# Altium project ARGUSPrjPcb.PrjPcb (part 1 of 2)
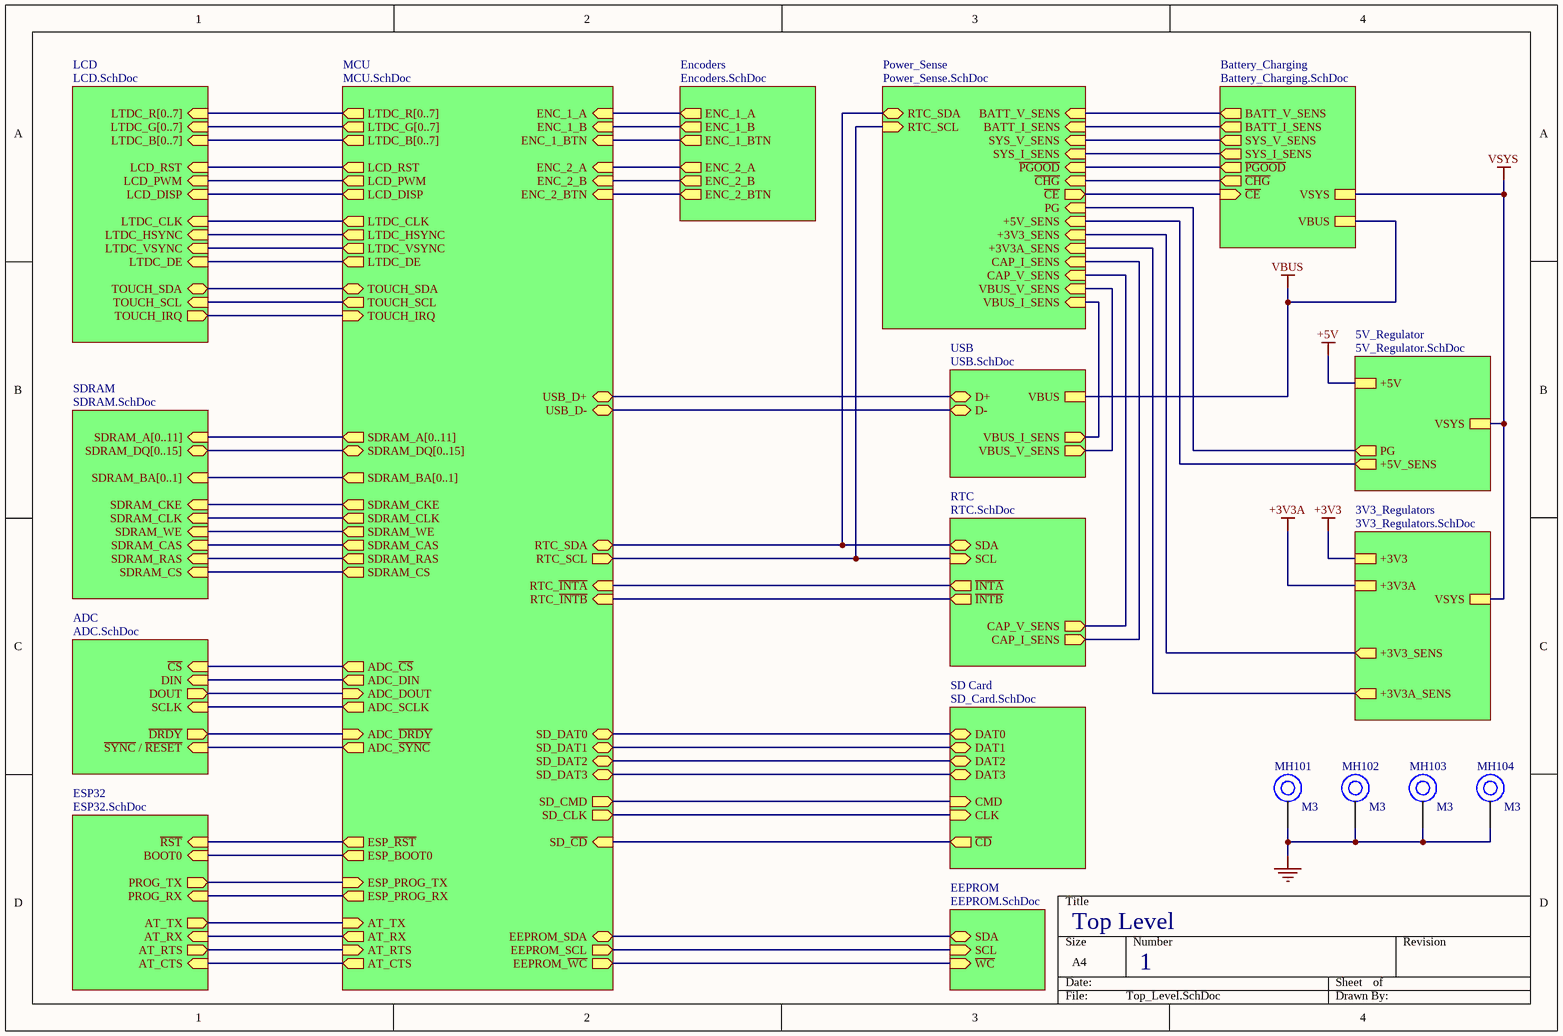
[diagram p0: Top_Level.SchDoc]
18 sheets, 452 parts. Net scope: hierarchical (ports join the sheet entries above them; power ports are global).
Board file: ARGUS.PcbDoc
Sheets:
  Top_Level.SchDoc
    MCU = MCU.SchDoc
      Designator = MCU_Peripherals.SchDoc
      MCU_Power = MCU_Power.SchDoc
    LCD = LCD.SchDoc
    SDRAM = SDRAM.SchDoc
    ADC = ADC.SchDoc
      CH0 = ADC_Frontend.SchDoc
      ADC_Frontend = ADC_Frontend.SchDoc
      ADC_Frontend = ADC_Frontend.SchDoc
      ADC_Frontend = ADC_Frontend.SchDoc
      ADC_Frontend = ADC_Frontend.SchDoc
      ADC_Frontend = ADC_Frontend.SchDoc
      ADC_Frontend = ADC_Frontend.SchDoc
      ADC_Frontend = ADC_Frontend.SchDoc
    Battery_Charging = Battery_Charging.SchDoc
    USB = USB.SchDoc
    EEPROM = EEPROM.SchDoc
    RTC = RTC.SchDoc
    SD Card = SD_Card.SchDoc
    5V_Regulator = 5V_Regulator.SchDoc
    3V3_Regulators = 3V3_Regulators.SchDoc
    ESP32 = ESP32.SchDoc
    Power_Sense = Power_Sense.SchDoc
    Encoders = Encoders.SchDoc

## Sheet Top_Level.SchDoc: Top Level
size A4; DocumentNumber: 1; SheetNumber: 1; SheetTotal: 18

### Parts
MH101  M3  [M3_Mounting_Hole]
MH102  M3  [M3_Mounting_Hole]
MH103  M3  [M3_Mounting_Hole]
MH104  M3  [M3_Mounting_Hole]

### Sub-sheets
3V3_Regulators = 3V3_Regulators.SchDoc: +3V3, VSYS, +3V3_SENS (out), +3V3A, +3V3A_SENS (out)
5V_Regulator = 5V_Regulator.SchDoc: +5V, VSYS, PG (out), +5V_SENS (out)
ADC = ADC.SchDoc: ~{CS} (in), DIN (in), DOUT (out), SCLK (in), ~{DRDY} (out), ~{SYNC} / ~{RESET} (in)
Battery_Charging = Battery_Charging.SchDoc: VBUS, BATT_V_SENS (out), BATT_I_SENS (out), SYS_V_SENS (out), SYS_I_SENS (out), ~{PGOOD} (out), ~{CHG} (out), ~{CE} (in), VSYS
EEPROM = EEPROM.SchDoc: SDA (bidir), SCL (in), ~{WC} (in)
Encoders = Encoders.SchDoc: ENC_1_A (out), ENC_1_B (out), ENC_1_BTN (out), ENC_2_BTN (out), ENC_2_B (out), ENC_2_A (out)
ESP32 = ESP32.SchDoc: ~{RST} (in), BOOT0 (in), PROG_RX (in), PROG_TX (out), AT_TX (out), AT_RX (in), AT_RTS (out), AT_CTS (in)
LCD = LCD.SchDoc: LTDC_B[0..7] (in), LTDC_G[0..7] (in), LTDC_R[0..7] (in), LCD_RST (in), LCD_PWM (in), TOUCH_SDA (bidir), TOUCH_SCL (in), TOUCH_IRQ (out), LTDC_DE (in), LTDC_VSYNC (in), LTDC_HSYNC (in), LTDC_CLK (in), LCD_DISP (in)
MCU = MCU.SchDoc: LTDC_B[0..7] (out), LTDC_G[0..7] (out), LTDC_R[0..7] (out), EEPROM_SDA (bidir), EEPROM_SCL (out), EEPROM_~{WC} (out), AT_CTS (out), AT_RTS (in), AT_RX (out), AT_TX (in), ESP_PROG_RX (out), ESP_PROG_TX (in), ESP_BOOT0 (out), ESP_~{RST} (out), ADC_~{SYNC} (out), ADC_~{DRDY} (in), ADC_SCLK (out), ADC_DOUT (in), ADC_DIN (out), ADC_~{CS} (out), SDRAM_CS (out), SDRAM_RAS (out), SDRAM_CAS (out), SDRAM_WE (out), SDRAM_CLK (out), SDRAM_CKE (out), SDRAM_BA[0..1] (out), SDRAM_DQ[0..15] (bidir), SDRAM_A[0..11] (out), LCD_RST (out), LCD_PWM (out), TOUCH_IRQ (in), TOUCH_SCL (out), TOUCH_SDA (bidir), LTDC_CLK (out), LCD_DISP (out), LTDC_HSYNC (out), LTDC_VSYNC (out), LTDC_DE (out), SD_~{CD} (in), SD_CLK (out), SD_CMD (out), SD_DAT3 (bidir), SD_DAT2 (bidir), SD_DAT1 (bidir), SD_DAT0 (bidir), RTC_~{INTB} (in), RTC_~{INTA} (in), RTC_SCL (out), RTC_SDA (bidir), USB_D- (bidir), USB_D+ (bidir), ENC_1_A (in), ENC_1_B (in), ENC_1_BTN (in), ENC_2_A (in), ENC_2_B (in), ENC_2_BTN (in)
Power_Sense = Power_Sense.SchDoc: BATT_V_SENS (in), BATT_I_SENS (in), SYS_V_SENS (in), SYS_I_SENS (in), ~{PGOOD} (in), ~{CHG} (in), ~{CE} (out), PG (in), +5V_SENS (in), +3V3_SENS (in), +3V3A_SENS (in), CAP_I_SENS (in), CAP_V_SENS (in), VBUS_V_SENS (in), VBUS_I_SENS (in), RTC_SDA (bidir), RTC_SCL (in)
RTC = RTC.SchDoc: SDA (bidir), SCL (in), ~{INTA} (out), ~{INTB} (out), CAP_I_SENS (out), CAP_V_SENS (out)
SD Card = SD_Card.SchDoc: DAT0 (bidir), DAT1 (bidir), DAT3 (bidir), DAT2 (bidir), CMD (in), CLK (in), ~{CD} (out)
SDRAM = SDRAM.SchDoc: SDRAM_BA[0..1] (in), SDRAM_A[0..11] (in), SDRAM_CKE (in), SDRAM_CLK (in), SDRAM_WE (in), SDRAM_CAS (in), SDRAM_RAS (in), SDRAM_CS (in), SDRAM_DQ[0..15] (bidir)
USB = USB.SchDoc: D+ (bidir), D- (bidir), VBUS, VBUS_V_SENS (out), VBUS_I_SENS (out)

### Nets
GND: MH101.1 MH102.1 MH103.1 MH104.1
VBUS: sheet Battery_Charging/VBUS, sheet USB/VBUS
VSYS: sheet Battery_Charging/VSYS, sheet 5V_Regulator/VSYS, sheet 3V3_Regulators/VSYS
+3V3_V_SENS: sheet 3V3_Regulators/+3V3_SENS, sheet Power_Sense/+3V3_SENS
+3V3A_V_SENS: sheet 3V3_Regulators/+3V3A_SENS, sheet Power_Sense/+3V3A_SENS
+5V_SENS: sheet 5V_Regulator/+5V_SENS, sheet Power_Sense/+5V_SENS
ADC_~{CS}: sheet MCU/ADC_~{CS}, sheet ADC/~{CS}
ADC_~{DRDY}: sheet MCU/ADC_~{DRDY}, sheet ADC/~{DRDY}
ADC_DIN: sheet MCU/ADC_DIN, sheet ADC/DIN
ADC_DOUT: sheet MCU/ADC_DOUT, sheet ADC/DOUT
ADC_~{SYNC}: sheet MCU/ADC_~{SYNC}, sheet ADC/~{SYNC} / ~{RESET}
ADC_SCLK: sheet MCU/ADC_SCLK, sheet ADC/SCLK
AT_CTS: sheet MCU/AT_CTS, sheet ESP32/AT_CTS
AT_RTS: sheet MCU/AT_RTS, sheet ESP32/AT_RTS
AT_RX: sheet MCU/AT_RX, sheet ESP32/AT_RX
AT_TX: sheet MCU/AT_TX, sheet ESP32/AT_TX
BATT_I_SENS: sheet Battery_Charging/BATT_I_SENS, sheet Power_Sense/BATT_I_SENS
BATT_V_SENS: sheet Battery_Charging/BATT_V_SENS, sheet Power_Sense/BATT_V_SENS
BOOT0: sheet MCU/ESP_BOOT0, sheet ESP32/BOOT0
~{CD}: sheet MCU/SD_~{CD}, sheet SD Card/~{CD}
~{CE}: sheet Battery_Charging/~{CE}, sheet Power_Sense/~{CE}
~{CHG}: sheet Battery_Charging/~{CHG}, sheet Power_Sense/~{CHG}
CAP_I_SENS: sheet RTC/CAP_I_SENS, sheet Power_Sense/CAP_I_SENS
CAP_V_SENS: sheet RTC/CAP_V_SENS, sheet Power_Sense/CAP_V_SENS
CLK: sheet MCU/SD_CLK, sheet SD Card/CLK
CMD: sheet MCU/SD_CMD, sheet SD Card/CMD
DAT0: sheet MCU/SD_DAT0, sheet SD Card/DAT0
DAT1: sheet MCU/SD_DAT1, sheet SD Card/DAT1
DAT2: sheet MCU/SD_DAT2, sheet SD Card/DAT2
DAT3: sheet MCU/SD_DAT3, sheet SD Card/DAT3
EEPROM_SCL: sheet MCU/EEPROM_SCL, sheet EEPROM/SCL
EEPROM_SDA: sheet MCU/EEPROM_SDA, sheet EEPROM/SDA
EEPROM_~{WC}: sheet MCU/EEPROM_~{WC}, sheet EEPROM/~{WC}
ENC_1_A: sheet MCU/ENC_1_A, sheet Encoders/ENC_1_A
ENC_1_B: sheet MCU/ENC_1_B, sheet Encoders/ENC_1_B
ENC_1_BTN: sheet MCU/ENC_1_BTN, sheet Encoders/ENC_1_BTN
ENC_2_A: sheet MCU/ENC_2_A, sheet Encoders/ENC_2_A
ENC_2_B: sheet MCU/ENC_2_B, sheet Encoders/ENC_2_B
ENC_2_BTN: sheet MCU/ENC_2_BTN, sheet Encoders/ENC_2_BTN
ESP_PROG_RX: sheet MCU/ESP_PROG_RX, sheet ESP32/PROG_RX
ESP_PROG_TX: sheet MCU/ESP_PROG_TX, sheet ESP32/PROG_TX
ESP_~{RST}: sheet MCU/ESP_~{RST}, sheet ESP32/~{RST}
~{INT}A: sheet MCU/RTC_~{INTA}, sheet RTC/~{INTA}
~{INT}B: sheet MCU/RTC_~{INTB}, sheet RTC/~{INTB}
LCD_DISP: sheet MCU/LCD_DISP, sheet LCD/LCD_DISP
LCD_PWM: sheet MCU/LCD_PWM, sheet LCD/LCD_PWM
LCD_RST: sheet MCU/LCD_RST, sheet LCD/LCD_RST
LTDC_CLK: sheet MCU/LTDC_CLK, sheet LCD/LTDC_CLK
LTDC_DE: sheet MCU/LTDC_DE, sheet LCD/LTDC_DE
LTDC_HSYNC: sheet MCU/LTDC_HSYNC, sheet LCD/LTDC_HSYNC
LTDC_VSYNC: sheet MCU/LTDC_VSYNC, sheet LCD/LTDC_VSYNC
~{PGOOD}: sheet Battery_Charging/~{PGOOD}, sheet Power_Sense/~{PGOOD}
PG: sheet 5V_Regulator/PG, sheet Power_Sense/PG
RTC_SCL: sheet MCU/RTC_SCL, sheet RTC/SCL, sheet Power_Sense/RTC_SCL
RTC_SDA: sheet MCU/RTC_SDA, sheet RTC/SDA, sheet Power_Sense/RTC_SDA
SDRAM_CAS: sheet MCU/SDRAM_CAS, sheet SDRAM/SDRAM_CAS
SDRAM_CKE: sheet MCU/SDRAM_CKE, sheet SDRAM/SDRAM_CKE
SDRAM_CLK: sheet MCU/SDRAM_CLK, sheet SDRAM/SDRAM_CLK
SDRAM_CS: sheet MCU/SDRAM_CS, sheet SDRAM/SDRAM_CS
SDRAM_RAS: sheet MCU/SDRAM_RAS, sheet SDRAM/SDRAM_RAS
SDRAM_WE: sheet MCU/SDRAM_WE, sheet SDRAM/SDRAM_WE
SYS_I_SENS: sheet Battery_Charging/SYS_I_SENS, sheet Power_Sense/SYS_I_SENS
SYS_V_SENS: sheet Battery_Charging/SYS_V_SENS, sheet Power_Sense/SYS_V_SENS
TOUCH_IRQ: sheet MCU/TOUCH_IRQ, sheet LCD/TOUCH_IRQ
TOUCH_SCL: sheet MCU/TOUCH_SCL, sheet LCD/TOUCH_SCL
TOUCH_SDA: sheet MCU/TOUCH_SDA, sheet LCD/TOUCH_SDA
USB_D_N: sheet MCU/USB_D-, sheet USB/D-
USB_D_P: sheet MCU/USB_D+, sheet USB/D+
VBUS_I_SENS: sheet USB/VBUS_I_SENS, sheet Power_Sense/VBUS_I_SENS
VBUS_V_SENS: sheet USB/VBUS_V_SENS, sheet Power_Sense/VBUS_V_SENS

### Buses and harness runs
bus sheet LCD/LTDC_B[0..7] = sheet MCU/LTDC_B[0..7]
bus sheet LCD/LTDC_G[0..7] = sheet MCU/LTDC_G[0..7]
bus sheet LCD/LTDC_R[0..7] = sheet MCU/LTDC_R[0..7]
bus sheet MCU/SDRAM_A[0..11] = sheet SDRAM/SDRAM_A[0..11]
bus sheet MCU/SDRAM_BA[0..1] = sheet SDRAM/SDRAM_BA[0..1]
bus sheet MCU/SDRAM_DQ[0..15] = sheet SDRAM/SDRAM_DQ[0..15]

### Library data of the parts
MH101-MH104 = M3_Mounting_Hole

## Sheet MCU.SchDoc: MCU
size A4; DocumentNumber: 2; SheetNumber: 2; SheetTotal: 18
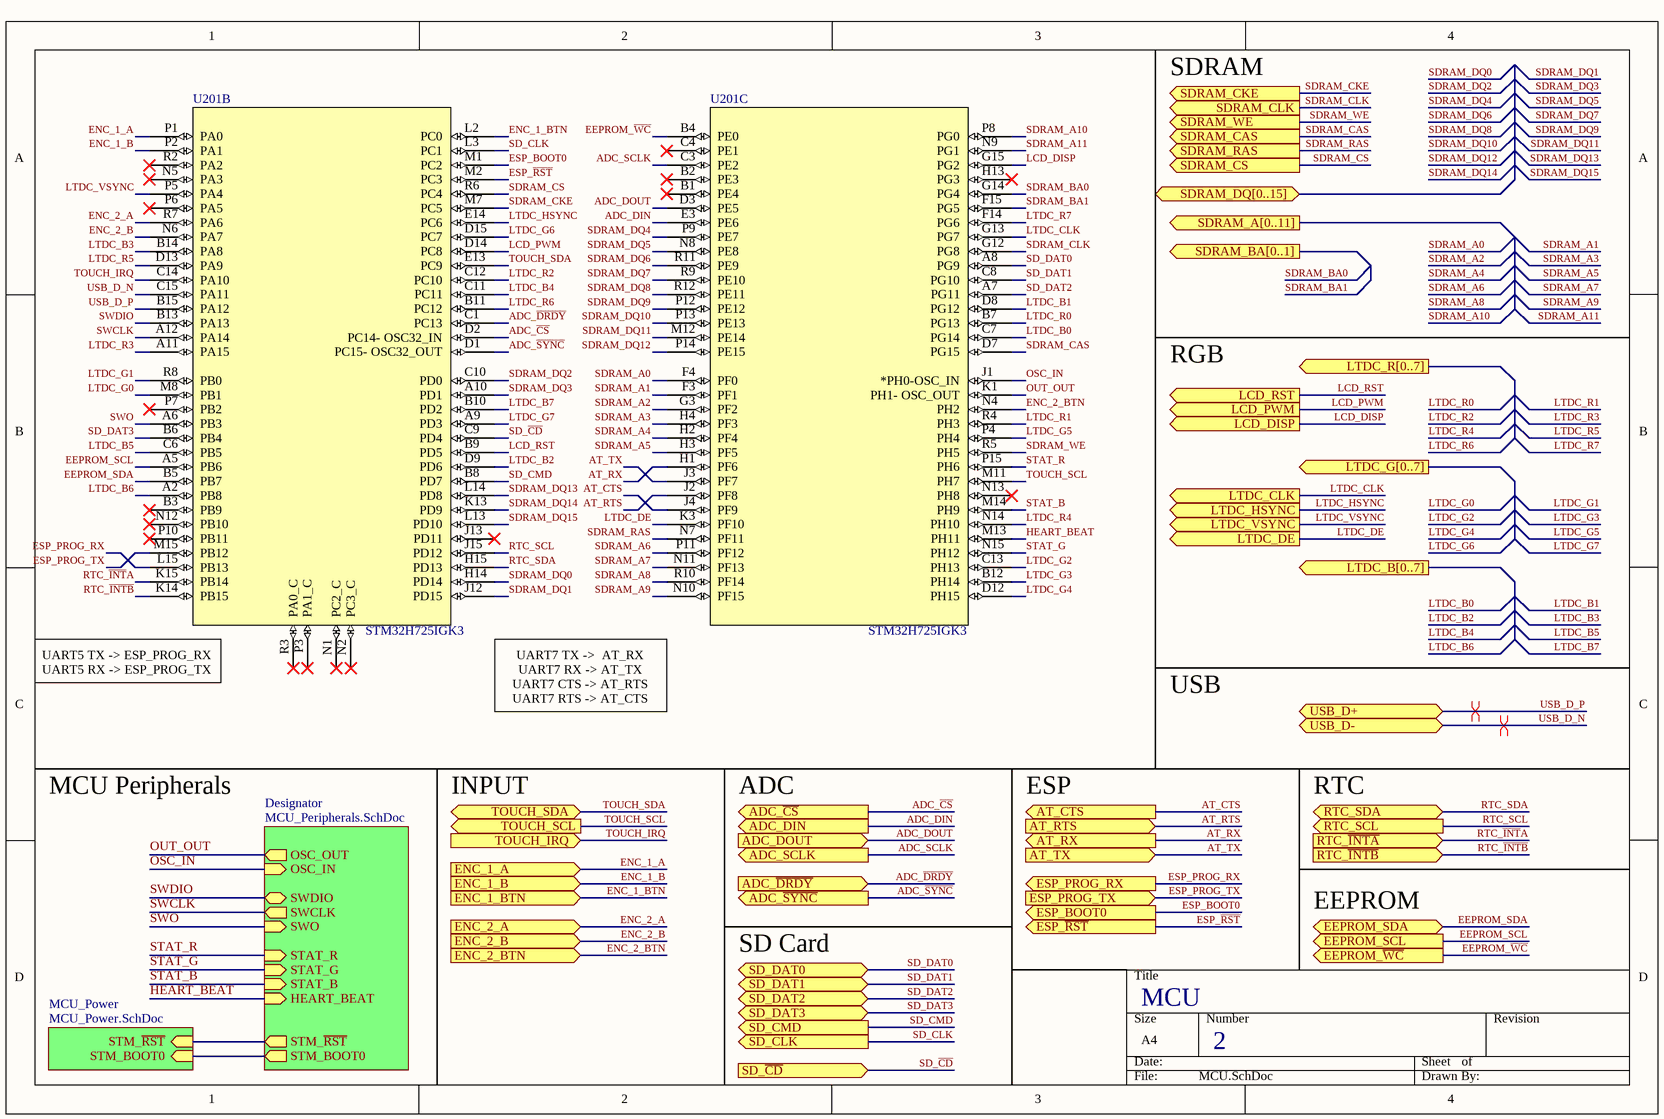
[diagram p1: MCU.SchDoc]

### Parts
U201  STM32H725IGK3  [STM32H725IGK3]  (parts B,C of 3)

### Sub-sheets
Designator = MCU_Peripherals.SchDoc: STM_BOOT0 (out), STM_~{RST} (out), OSC_IN (in), SWDIO (bidir), SWO (in), STAT_R (in), STAT_G (in), STAT_B (in), HEART_BEAT (in), OSC_OUT (out), SWCLK (out)
MCU_Power = MCU_Power.SchDoc: STM_~{RST} (in), STM_BOOT0 (in)

### Ports
ADC_DIN (out, see Top_Level[1C]), ADC_DOUT (in, see Top_Level[1C]), ADC_SCLK (out, see Top_Level[1C]), ADC_~{CS} (out, see Top_Level[1C]), ADC_~{DRDY} (in, see Top_Level[1C]), ADC_~{SYNC} (out, see Top_Level[1C]), AT_CTS (out, see Top_Level[1D], ESP32[4C]), AT_RTS (in, see Top_Level[1D], ESP32[4C]), AT_RX (out, see Top_Level[1D], ESP32[4C]), AT_TX (in, see Top_Level[1D], ESP32[4B]), EEPROM_SCL (out, see Top_Level[2D]), EEPROM_SDA (bidir, see Top_Level[2D]), EEPROM_~{WC} (out, see Top_Level[2D]), ENC_1_A (in, see Top_Level[2A], Encoders[2B]), ENC_1_B (in, see Top_Level[2A], Encoders[2B]), ENC_1_BTN (in, see Top_Level[2A], Encoders[2B]), ENC_2_A (in, see Top_Level[2A], Encoders[2A]), ENC_2_B (in, see Top_Level[2A], Encoders[2A]), ENC_2_BTN (in, see Top_Level[2A], Encoders[2B]), ESP_BOOT0 (out, see Top_Level[1D]), ESP_PROG_RX (out, see Top_Level[1D]), ESP_PROG_TX (in, see Top_Level[1D]), ESP_~{RST} (out, see Top_Level[1D]), LCD_DISP (out, see Top_Level[1A], LCD[1C]), LCD_PWM (out, see Top_Level[1A], LCD[1C]), LCD_RST (out, see Top_Level[1A], LCD[1C]), LTDC_B[0..7] (out, see Top_Level[1A], LCD[4A]), LTDC_CLK (out, see Top_Level[1A], LCD[4C]), LTDC_DE (out, see Top_Level[1B], LCD[4C]), LTDC_G[0..7] (out, see Top_Level[1A], LCD[3A]), LTDC_HSYNC (out, see Top_Level[1A], LCD[4C]), LTDC_R[0..7] (out, see Top_Level[1A], LCD[2A]), LTDC_VSYNC (out, see Top_Level[1A], LCD[1C]), RTC_SCL (out, see Top_Level[2C], Power_Sense[3B]), RTC_SDA (bidir, see Top_Level[2C], Power_Sense[3B]), RTC_~{INTA} (in, see Top_Level[2C]), RTC_~{INTB} (in, see Top_Level[2C]), SD_CLK (out, see Top_Level[2D]), SD_CMD (out, see Top_Level[2D]), SD_DAT0 (bidir, see Top_Level[2C]), SD_DAT1 (bidir, see Top_Level[2C]), SD_DAT2 (bidir, see Top_Level[2C]), SD_DAT3 (bidir, see Top_Level[2D]), SD_~{CD} (in, see Top_Level[2D]), SDRAM_A[0..11] (out, see Top_Level[1B], SDRAM[3C]), SDRAM_BA[0..1] (out, see Top_Level[1B], SDRAM[1B]), SDRAM_CAS (out, see Top_Level[1C], SDRAM[1B]), SDRAM_CKE (out, see Top_Level[1B], SDRAM[1B]), SDRAM_CLK (out, see Top_Level[1C], SDRAM[1B]), SDRAM_CS (out, see Top_Level[1C], SDRAM[1B]), SDRAM_DQ[0..15] (bidir, see Top_Level[1B], SDRAM[3A]), SDRAM_RAS (out, see Top_Level[1C], SDRAM[1B]), SDRAM_WE (out, see Top_Level[1C], SDRAM[1B]), TOUCH_IRQ (in, see Top_Level[1B], LCD[4C]), TOUCH_SCL (out, see Top_Level[1B], LCD[4C]), TOUCH_SDA (bidir, see Top_Level[1B], LCD[1C]), USB_D+ (bidir, see Top_Level[2B]), USB_D- (bidir, see Top_Level[2B])

### Nets
ADC_~{CS}: U201.D2(PC14-_OSC32_IN) ; port ADC_~{CS}
ADC_~{DRDY}: U201.C1(PC13) ; port ADC_~{DRDY}
ADC_DIN: U201.E3(PE6) ; port ADC_DIN
ADC_DOUT: U201.D3(PE5) ; port ADC_DOUT
ADC_~{SYNC}: U201.D1(PC15-_OSC32_OUT) ; port ADC_~{SYNC}
ADC_SCLK: U201.C3(PE2) ; port ADC_SCLK
AT_CTS: U201.J4(PF9) ; port AT_CTS
AT_RTS: U201.J2(PF8) ; port AT_RTS
AT_RX: U201.H1(PF6) ; port AT_RX
AT_TX: U201.J3(PF7) ; port AT_TX
EEPROM_SCL: U201.A5(PB6) ; port EEPROM_SCL
EEPROM_SDA: U201.B5(PB7) ; port EEPROM_SDA
EEPROM_~{WC}: U201.B4(PE0) ; port EEPROM_~{WC}
ENC_1_A: U201.P1(PA0) ; port ENC_1_A
ENC_1_B: U201.P2(PA1) ; port ENC_1_B
ENC_1_BTN: U201.L2(PC0) ; port ENC_1_BTN
ENC_2_A: U201.R7(PA6) ; port ENC_2_A
ENC_2_B: U201.N6(PA7) ; port ENC_2_B
ENC_2_BTN: U201.N4(PH2) ; port ENC_2_BTN
ESP_BOOT0: U201.M1(PC2) ; port ESP_BOOT0  [project net BOOT0]
ESP_PROG_RX: U201.L15(PB13) ; port ESP_PROG_RX
ESP_PROG_TX: U201.M15(PB12) ; port ESP_PROG_TX
ESP_~{RST}: U201.M2(PC3) ; port ESP_~{RST}
HEART_BEAT: U201.M13(PH11) ; sheet Designator/HEART_BEAT
LCD_DISP: U201.G15(PG2) ; port LCD_DISP
LCD_PWM: U201.D14(PC8) ; port LCD_PWM
LCD_RST: U201.B9(PD5) ; port LCD_RST
LTDC_B0: U201.C7(PG14)
LTDC_B1: U201.D8(PG12)
LTDC_B2: U201.D9(PD6)
LTDC_B3: U201.B14(PA8)
LTDC_B4: U201.C11(PC11)
LTDC_B5: U201.C6(PB5)
LTDC_B6: U201.A2(PB8)
LTDC_B7: U201.B10(PD2)
LTDC_CLK: U201.G13(PG7) ; port LTDC_CLK
LTDC_DE: U201.K3(PF10) ; port LTDC_DE
LTDC_G0: U201.M8(PB1)
LTDC_G1: U201.R8(PB0)
LTDC_G2: U201.C13(PH13)
LTDC_G3: U201.B12(PH14)
LTDC_G4: U201.D12(PH15)
LTDC_G5: U201.P4(PH4)
LTDC_G6: U201.D15(PC7)
LTDC_G7: U201.A9(PD3)
LTDC_HSYNC: U201.E14(PC6) ; port LTDC_HSYNC
LTDC_R0: U201.B7(PG13)
LTDC_R1: U201.R4(PH3)
LTDC_R2: U201.C12(PC10)
LTDC_R3: U201.A11(PA15)
LTDC_R4: U201.N14(PH10)
LTDC_R5: U201.D13(PA9)
LTDC_R6: U201.B11(PC12)
LTDC_R7: U201.F14(PG6)
LTDC_VSYNC: U201.P5(PA4) ; port LTDC_VSYNC
OSC_IN: U201.J1(*PH0-OSC_IN) ; sheet Designator/OSC_IN
OUT_OUT: U201.K1(PH1-_OSC_OUT) ; sheet Designator/OSC_OUT
~{RST}: sheet Designator/STM_~{RST}, sheet MCU_Power/STM_~{RST}
RTC_~{INT}A: U201.K15(PB14) ; port RTC_~{INTA}  [project net ~{INT}A]
RTC_~{INTB}: U201.K14(PB15) ; port RTC_~{INTB}  [project net ~{INT}B]
RTC_SCL: U201.J15(PD12) ; port RTC_SCL
RTC_SDA: U201.H15(PD13) ; port RTC_SDA
SD_~{CD}: U201.C9(PD4) ; port SD_~{CD}  [project net ~{CD}]
SD_CLK: U201.L3(PC1) ; port SD_CLK  [project net CLK]
SD_CMD: U201.B8(PD7) ; port SD_CMD  [project net CMD]
SD_DAT0: U201.A8(PG9) ; port SD_DAT0  [project net DAT0]
SD_DAT1: U201.C8(PG10) ; port SD_DAT1  [project net DAT1]
SD_DAT2: U201.A7(PG11) ; port SD_DAT2  [project net DAT2]
SD_DAT3: U201.B6(PB4) ; port SD_DAT3  [project net DAT3]
SDRAM_A0: U201.F4(PF0)
SDRAM_A1: U201.F3(PF1)
SDRAM_A2: U201.G3(PF2)
SDRAM_A3: U201.H4(PF3)
SDRAM_A4: U201.H2(PF4)
SDRAM_A5: U201.H3(PF5)
SDRAM_A6: U201.P11(PF12)
SDRAM_A7: U201.N11(PF13)
SDRAM_A8: U201.R10(PF14)
SDRAM_A9: U201.N10(PF15)
SDRAM_A10: U201.P8(PG0)
SDRAM_A11: U201.N9(PG1)
SDRAM_BA0: U201.G14(PG4)
SDRAM_BA1: U201.F15(PG5)
SDRAM_CAS: U201.D7(PG15) ; port SDRAM_CAS
SDRAM_CKE: U201.M7(PC5) ; port SDRAM_CKE
SDRAM_CLK: U201.G12(PG8) ; port SDRAM_CLK
SDRAM_CS: U201.R6(PC4) ; port SDRAM_CS
SDRAM_DQ0: U201.H14(PD14)
SDRAM_DQ1: U201.J12(PD15)
SDRAM_DQ2: U201.C10(PD0)
SDRAM_DQ3: U201.A10(PD1)
SDRAM_DQ4: U201.P9(PE7)
SDRAM_DQ5: U201.N8(PE8)
SDRAM_DQ6: U201.R11(PE9)
SDRAM_DQ7: U201.R9(PE10)
SDRAM_DQ8: U201.R12(PE11)
SDRAM_DQ9: U201.P12(PE12)
SDRAM_DQ10: U201.P13(PE13)
SDRAM_DQ11: U201.M12(PE14)
SDRAM_DQ12: U201.P14(PE15)
SDRAM_DQ13: U201.L14(PD8)
SDRAM_DQ14: U201.K13(PD9)
SDRAM_DQ15: U201.L13(PD10)
SDRAM_RAS: U201.N7(PF11) ; port SDRAM_RAS
SDRAM_WE: U201.R5(PH5) ; port SDRAM_WE
STAT_B: U201.M14(PH9) ; sheet Designator/STAT_B
STAT_G: U201.N15(PH12) ; sheet Designator/STAT_G
STAT_R: U201.P15(PH6) ; sheet Designator/STAT_R
STM_BOOT0: sheet Designator/STM_BOOT0, sheet MCU_Power/STM_BOOT0
SWCLK: U201.A12(PA14) ; sheet Designator/SWCLK
SWDIO: U201.B13(PA13) ; sheet Designator/SWDIO
SWO: U201.A6(PB3) ; sheet Designator/SWO
TOUCH_IRQ: U201.C14(PA10) ; port TOUCH_IRQ
TOUCH_SCL: U201.M11(PH7) ; port TOUCH_SCL
TOUCH_SDA: U201.E13(PC9) ; port TOUCH_SDA
USB_D_N: U201.C15(PA11) ; port USB_D-
USB_D_P: U201.B15(PA12) ; port USB_D+

Not connected (* = marked no-connect by the designer): U201 B1(PE4)* B2(PE3)* B3(PB9)* C4(PE1)* H13(PG3)* J13(PD11)* N1(PC2_C)* N2(PC3_C)* N5(PA3)* N12(PB10)* N13(PH8)* P3(PA1_C)* P6(PA5)* P7(PB2)* P10(PB11)* R2(PA2)* R3(PA0_C)*

### Layout directives
differential pair: USB_D_N, USB_D_P

### Notes on the sheet
- SDRAM
- RGB
- (near U201) UART5 TX -> ESP_PROG_RX
  UART5 RX -> ESP_PROG_TX
- (near U201) UART7 TX ->  AT_RX
  UART7 RX -> AT_TX
  UART7 CTS -> AT_RTS
  UART7 RTS -> AT_CTS
- USB
- MCU Peripherals
- INPUT
- ADC
- ESP
- RTC
- SD Card
- EEPROM

### Library data of the parts
U201 = STM32H725IGK3: High-performance and DSP with DP-FPU, Arm Cortex-M7 MCU with 1 MByte Flash, 564 KBytes RAM, 550 MHz CPU, L1 cache, external memory interface, SMPS, subset of peripherals; Manufacturer_Name: STMicroelectronics; Manufacturer_Part_Number: STM32H725IGK3; RefDes: RefDes; Type: Type; Supplier 1: Future Electronics; Supplier Part Number 1: STM32H725IGK3

## Sheet MCU_Peripherals.SchDoc: MCU Peripherals
size A4; DocumentNumber: 4; SheetNumber: 4; SheetTotal: 17
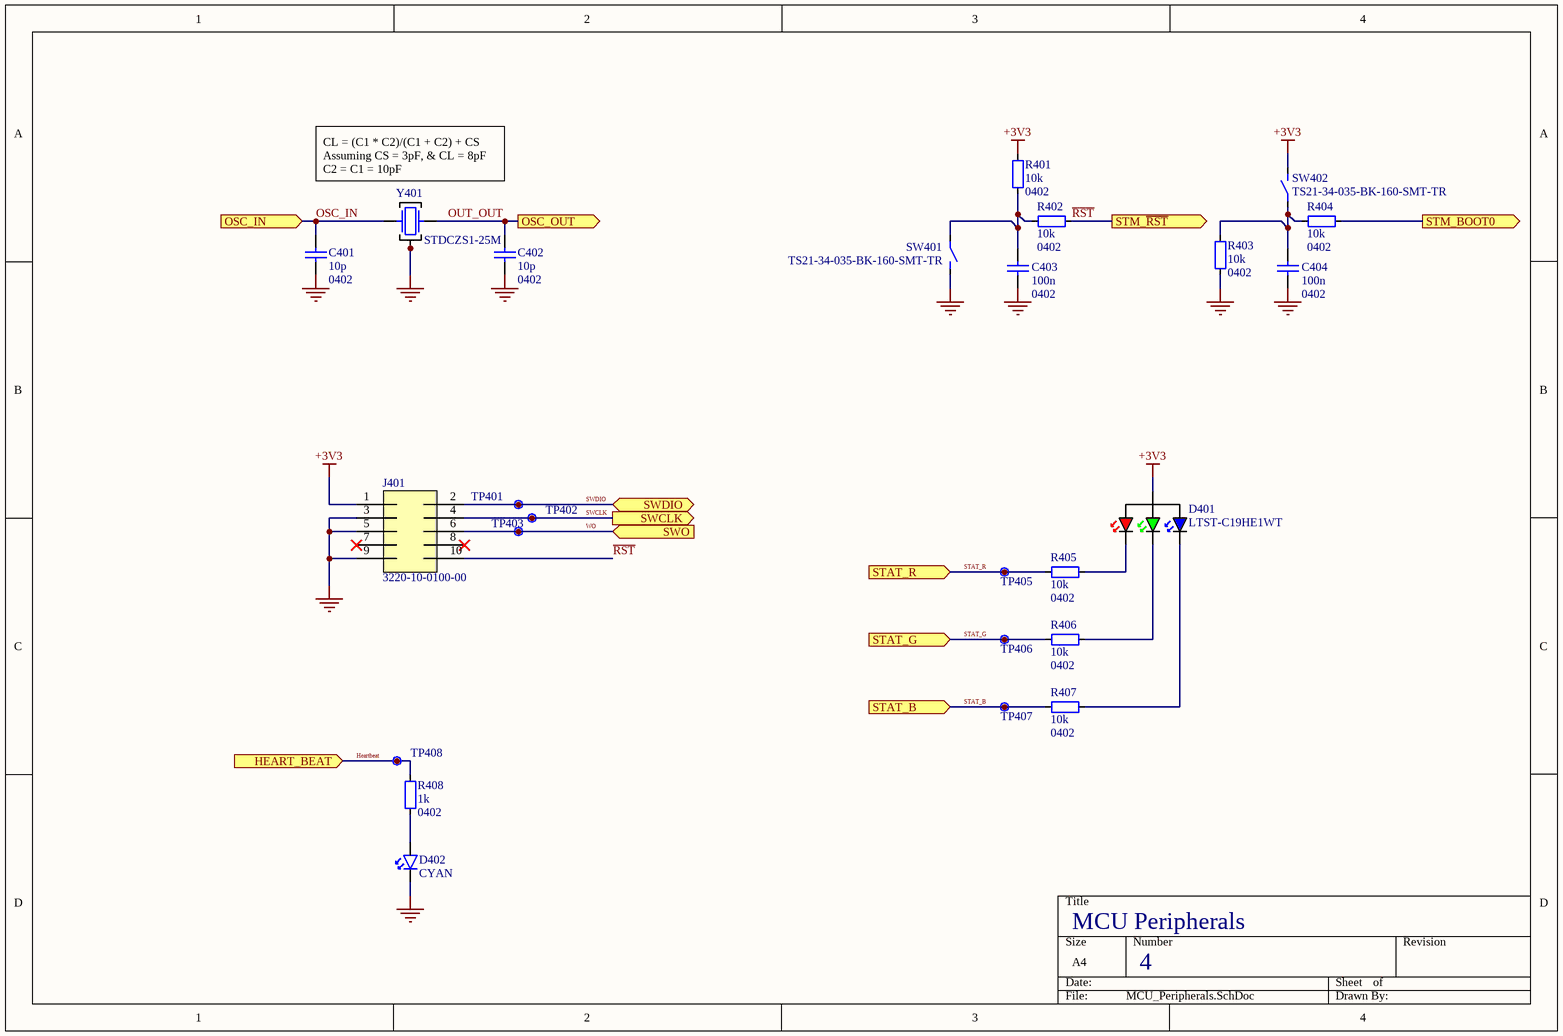
[diagram p2: MCU_Peripherals.SchDoc]

### Parts
C401  10p  Footprint: 0402  [CAP_0402_B]
C402  10p  Footprint: 0402  [CAP_0402_B]
C403  100n  Footprint: 0402  [CAP_0402_B]
C404  100n  Footprint: 0402  [CAP_0402_B]
D401  LTST-C19HE1WT  [LTST-C19HE1WT]
D402  CYAN  [SMLD12E3N1WT86]
J401  3220-10-0100-00  [3220-10-0100-00]
R401  10k  Footprint: 0402  [RES_0402_A]
R402  10k  Footprint: 0402  [RES_0402_A]
R403  10k  Footprint: 0402  [RES_0402_A]
R404  10k  Footprint: 0402  [RES_0402_A]
R405  10k  Footprint: 0402  [RES_0402_A]
R406  10k  Footprint: 0402  [RES_0402_A]
R407  10k  Footprint: 0402  [RES_0402_A]
R408  1k  Footprint: 0402  [RES_0402_A]
SW401  TS21-34-035-BK-160-SMT-TR  [TS21-34-035-BK-160-SMT-TR]
SW402  TS21-34-035-BK-160-SMT-TR  [TS21-34-035-BK-160-SMT-TR]
TP401  Net  [Unlabelled Testpoint]  (value not drawn)
TP402  Net  [Unlabelled Testpoint]  (value not drawn)
TP403  Net  [Unlabelled Testpoint]  (value not drawn)
TP405  Net  [Unlabelled Testpoint]  (value not drawn)
TP406  Net  [Unlabelled Testpoint]  (value not drawn)
TP407  Net  [Unlabelled Testpoint]  (value not drawn)
TP408  Net  [Unlabelled Testpoint]  (value not drawn)
Y401  STDCZS1-25M  [STDCZS1-25M]

### Ports
HEART_BEAT (in, see MCU[1D]), OSC_IN (in, see MCU[1D]), OSC_OUT (out, see MCU[1D]), STAT_B (in, see MCU[1D]), STAT_G (in, see MCU[1D]), STAT_R (in, see MCU[1D]), STM_BOOT0 (out, see MCU[1D], MCU_Power[2B]), STM_~{RST} (out, see MCU[1D], MCU_Power[2B]), SWCLK (out, see MCU[1D]), SWDIO (bidir, see MCU[1D]), SWO (in, see MCU[1D])

### Nets
+3V3: D401.4 J401.1 R401.2(a) SW402.2
GND: C401.2 C402.2 C403.2 C404.2 D402.2 J401.3 J401.5 J401.9 R403.1(a) SW401.2 Y401.2(GND) Y401.4(GND)
Heartbeat: R408.1(a) TP408.1 ; port HEART_BEAT  [project net HEART_BEAT]
OSC_IN: C401.1 Y401.3(IO) ; port OSC_IN
OUT_OUT: C402.1 Y401.1(IO) ; port OSC_OUT
~{RST}: J401.10 R402.2(a) ; port STM_~{RST}
STAT_B: R407.1(a) TP407.1 ; port STAT_B
STAT_G: R406.1(a) TP406.1 ; port STAT_G
STAT_R: R405.1(a) TP405.1 ; port STAT_R
STM_BOOT0: R404.2(a) ; port STM_BOOT0
SWCLK: J401.4 TP402.1 ; port SWCLK
SWDIO: J401.2 TP401.1 ; port SWDIO
WO: J401.6 TP403.1 ; port SWO  [project net SWO]
NetC403_1: C403.1 R401.1(a) R402.1(a) SW401.1
NetC404_1: C404.1 R403.2(a) R404.1(a) SW402.1
NetD401_1: D401.1 R405.2(a)
NetD401_2: D401.2 R406.2(a)
NetD401_3: D401.3 R407.2(a)
NetD402_1: D402.1 R408.2(a)

Not connected (* = marked no-connect by the designer): J401 7(2)* 8(2)*

### Notes on the sheet
- (near Y401) CL = (C1 * C2)/(C1 + C2) + CS
  Assuming CS = 3pF, & CL = 8pF
  C2 = C1 = 10pF

### Library data of the parts
C401-C404 = CAP_0402: 0402 SMD Capacitor
D401 = LTST-C19HE1WT: Red, Green, Blue (RGB) 624nm Red, 525nm Green, 470nm Blue LED Indication - Discrete 2.1V Red, 3.35V Green, 3.35V Blue 0606 (1616 Metric); Supplier 1: Arrow Electronics; Supplier Part Number 1: LTST-C19HE1WT
D402 = LED_Generic: Part Number: SMLD12E3N1WT86; Supplier 1: DigiKey; Supplier Part Number 1: SMLD12E3N1WT86CT-ND
J401 = 3220-10-0100-00: Connector Header Through Hole 10 position 0.050" (1.27mm); Supplier 1: DigiKey; Supplier Part Number 1: 1175-1627-ND
R401-R408 = RES_0402: 0402 SMD Resistor
SW401 SW402 = TS21-34-035-BK-160-SMT-TR: Tactile Switch SPST-NO Top Actuated Surface Mount; Supplier 1: DigiKey; Supplier Part Number 1: 2223-TS21-34-035-BK-160-SMT-TRDKR-ND
TP401-TP403 TP405-TP408 = Unlabelled Testpoint: Symbol for an unlabelled testpoint
Y401 = STDCZS1-25M: 25 MHz ±15ppm Crystal 8pF 80 Ohms 4-SMD, No Lead; Supplier 1: DigiKey; Supplier Part Number 1: 644-STDCZS1-25MDKR-ND

## Sheet MCU_Power.SchDoc: MCU Power
size A4; DocumentNumber: 3; SheetNumber: 3; SheetTotal: 16
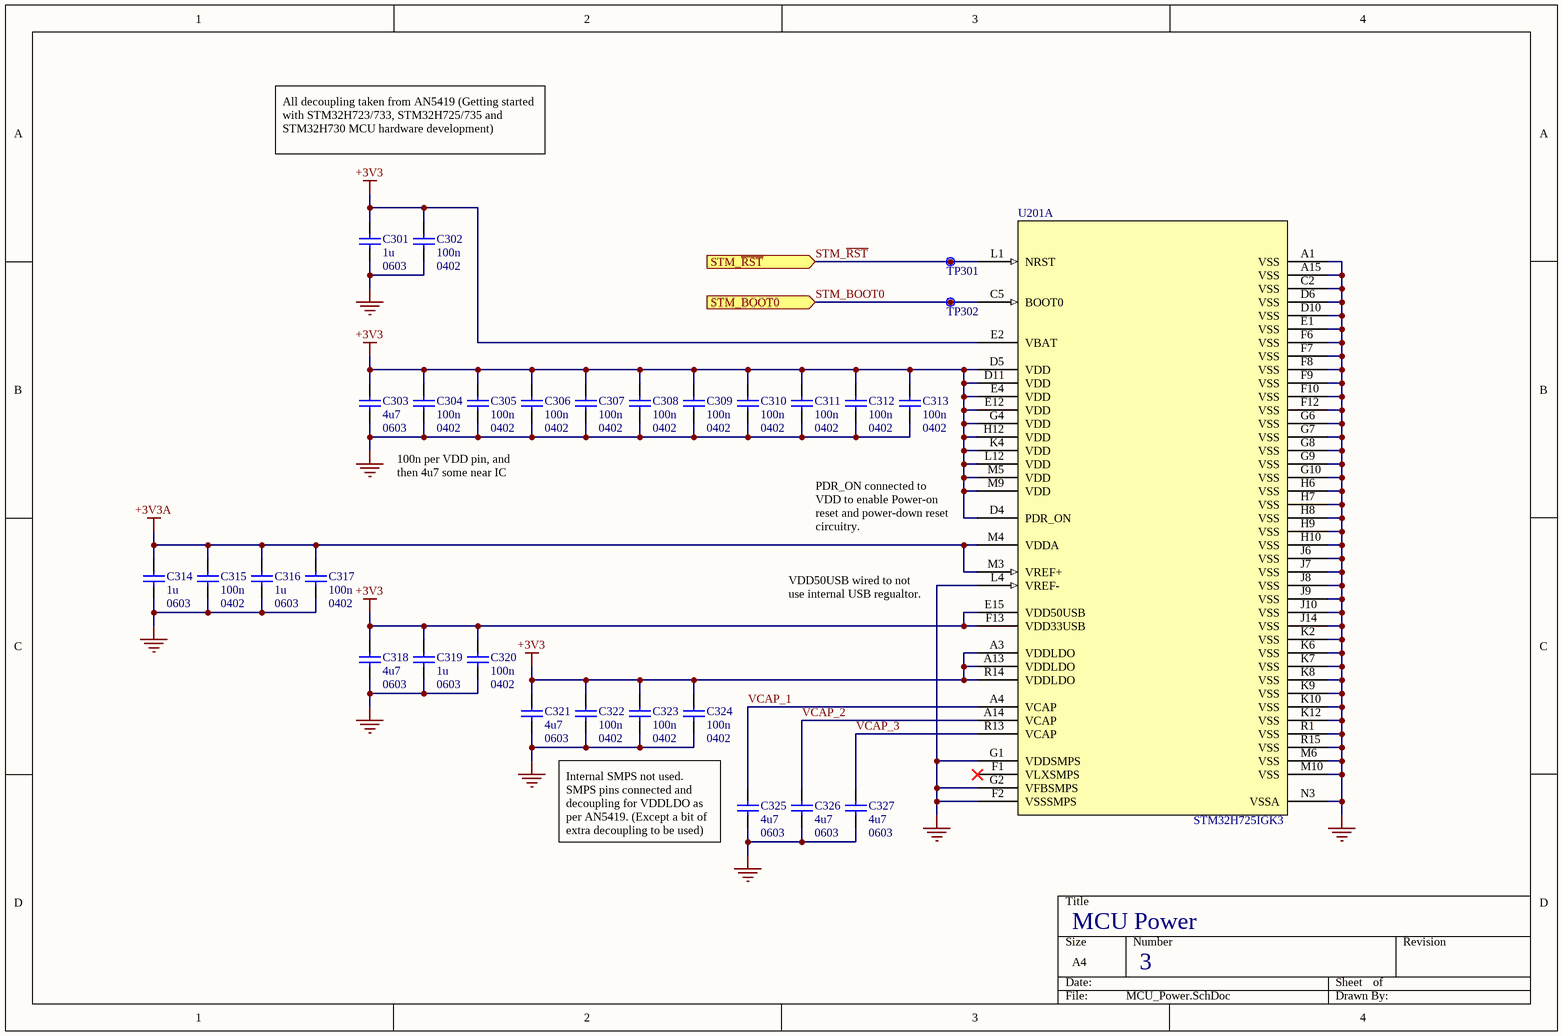
[diagram p3: MCU_Power.SchDoc]

### Parts
C301  1u  Footprint: 0603  [CAP_0603_B]
C302  100n  Footprint: 0402  [CAP_0402_B]
C303  4u7  Footprint: 0603  [CAP_0603_B]
C304  100n  Footprint: 0402  [CAP_0402_B]
C305  100n  Footprint: 0402  [CAP_0402_B]
C306  100n  Footprint: 0402  [CAP_0402_B]
C307  100n  Footprint: 0402  [CAP_0402_B]
C308  100n  Footprint: 0402  [CAP_0402_B]
C309  100n  Footprint: 0402  [CAP_0402_B]
C310  100n  Footprint: 0402  [CAP_0402_B]
C311  100n  Footprint: 0402  [CAP_0402_B]
C312  100n  Footprint: 0402  [CAP_0402_B]
C313  100n  Footprint: 0402  [CAP_0402_B]
C314  1u  Footprint: 0603  [CAP_0603_B]
C315  100n  Footprint: 0402  [CAP_0402_B]
C316  1u  Footprint: 0603  [CAP_0603_B]
C317  100n  Footprint: 0402  [CAP_0402_B]
C318  4u7  Footprint: 0603  [CAP_0603_B]
C319  1u  Footprint: 0603  [CAP_0603_B]
C320  100n  Footprint: 0402  [CAP_0402_B]
C321  4u7  Footprint: 0603  [CAP_0603_B]
C322  100n  Footprint: 0402  [CAP_0402_B]
C323  100n  Footprint: 0402  [CAP_0402_B]
C324  100n  Footprint: 0402  [CAP_0402_B]
C325  4u7  Footprint: 0603  [CAP_0603_B]
C326  4u7  Footprint: 0603  [CAP_0603_B]
C327  4u7  Footprint: 0603  [CAP_0603_B]
TP301  Net  [Unlabelled Testpoint]  (value not drawn)
TP302  Net  [Unlabelled Testpoint]  (value not drawn)
U201  STM32H725IGK3  [STM32H725IGK3]  (part A of 3)

### Ports
STM_BOOT0 (in, see MCU[1D], MCU_Peripherals[4A]), STM_~{RST} (in, see MCU[1D], MCU_Peripherals[3A])

### Nets
+3V3: C301.1 C302.1 C303.1 C304.1 C305.1 C306.1 C307.1 C308.1 C309.1 C310.1 C311.1 C312.1 C313.1 C318.1 C319.1 C320.1 C321.1 C322.1 C323.1 C324.1 U201.A3(VDDLDO) U201.A13(VDDLDO) U201.D4(PDR_ON) U201.D5(VDD) U201.D11(VDD) U201.E2(VBAT) U201.E4(VDD) U201.E12(VDD) U201.E15(VDD50USB) U201.F13(VDD33USB) U201.G4(VDD) U201.H12(VDD) U201.K4(VDD) U201.L12(VDD) U201.M5(VDD) U201.M9(VDD) U201.R14(VDDLDO)
+3V3A: C314.1 C315.1 C316.1 C317.1 U201.M3(VREF+) U201.M4(VDDA)
GND: C301.2 C302.2 C303.2 C304.2 C305.2 C306.2 C307.2 C308.2 C309.2 C310.2 C311.2 C312.2 C313.2 C314.2 C315.2 C316.2 C317.2 C318.2 C319.2 C320.2 C321.2 C322.2 C323.2 C324.2 C325.2 C326.2 C327.2 U201.A1(VSS) U201.A15(VSS) U201.C2(VSS) U201.D6(VSS) U201.D10(VSS) U201.E1(VSS) U201.F2(VSSSMPS) U201.F6(VSS) U201.F7(VSS) U201.F8(VSS) U201.F9(VSS) U201.F10(VSS) U201.F12(VSS) U201.G1(VDDSMPS) U201.G2(VFBSMPS) U201.G6(VSS) U201.G7(VSS) U201.G8(VSS) U201.G9(VSS) U201.G10(VSS) U201.H6(VSS) U201.H7(VSS) U201.H8(VSS) U201.H9(VSS) U201.H10(VSS) U201.J6(VSS) U201.J7(VSS) U201.J8(VSS) U201.J9(VSS) U201.J10(VSS) U201.J14(VSS) U201.K2(VSS) U201.K6(VSS) U201.K7(VSS) U201.K8(VSS) U201.K9(VSS) U201.K10(VSS) U201.K12(VSS) U201.L4(VREF-) U201.M6(VSS) U201.M10(VSS) U201.N3(VSSA) U201.R1(VSS) U201.R15(VSS)
STM_BOOT0: TP302.1 U201.C5(BOOT0) ; port STM_BOOT0
STM_~{RST}: TP301.1 U201.L1(NRST) ; port STM_~{RST}  [project net ~{RST}]
VCAP_1: C325.1 U201.A4(VCAP)
VCAP_2: C326.1 U201.A14(VCAP)
VCAP_3: C327.1 U201.R13(VCAP)

Not connected (* = marked no-connect by the designer): U201 F1(VLXSMPS)*

### Notes on the sheet
- All decoupling taken from AN5419 (Getting started with STM32H723/733, STM32H725/735 and STM32H730 MCU hardware development)
- 100n per VDD pin, and then 4u7 some near IC
- PDR_ON connected to VDD to enable Power-on reset and power-down reset circuitry.
- VDD50USB wired to not use internal USB regualtor.
- Internal SMPS not used. SMPS pins connected and decoupling for VDDLDO as per AN5419. (Except a bit of extra decoupling to be used)

### Library data of the parts
C301 C303 C314 C316 C318 C319 C321 C325-C327 = CAP_0603: 0603 SMD Capacitor
C302 C304-C313 C315 C317 C320 C322-C324 = CAP_0402: 0402 SMD Capacitor
TP301 TP302 = Unlabelled Testpoint: Symbol for an unlabelled testpoint
U201 = STM32H725IGK3: as U201 on sheet MCU; Manufacturer_Part_Number: STM32H725IGK3; RefDes: RefDes; Type: Type; Supplier 1: Future Electronics; Supplier Part Number 1: STM32H725IGK3

## Sheet LCD.SchDoc: LCD
size A4; DocumentNumber: 7; SheetNumber: 13; SheetTotal: 16
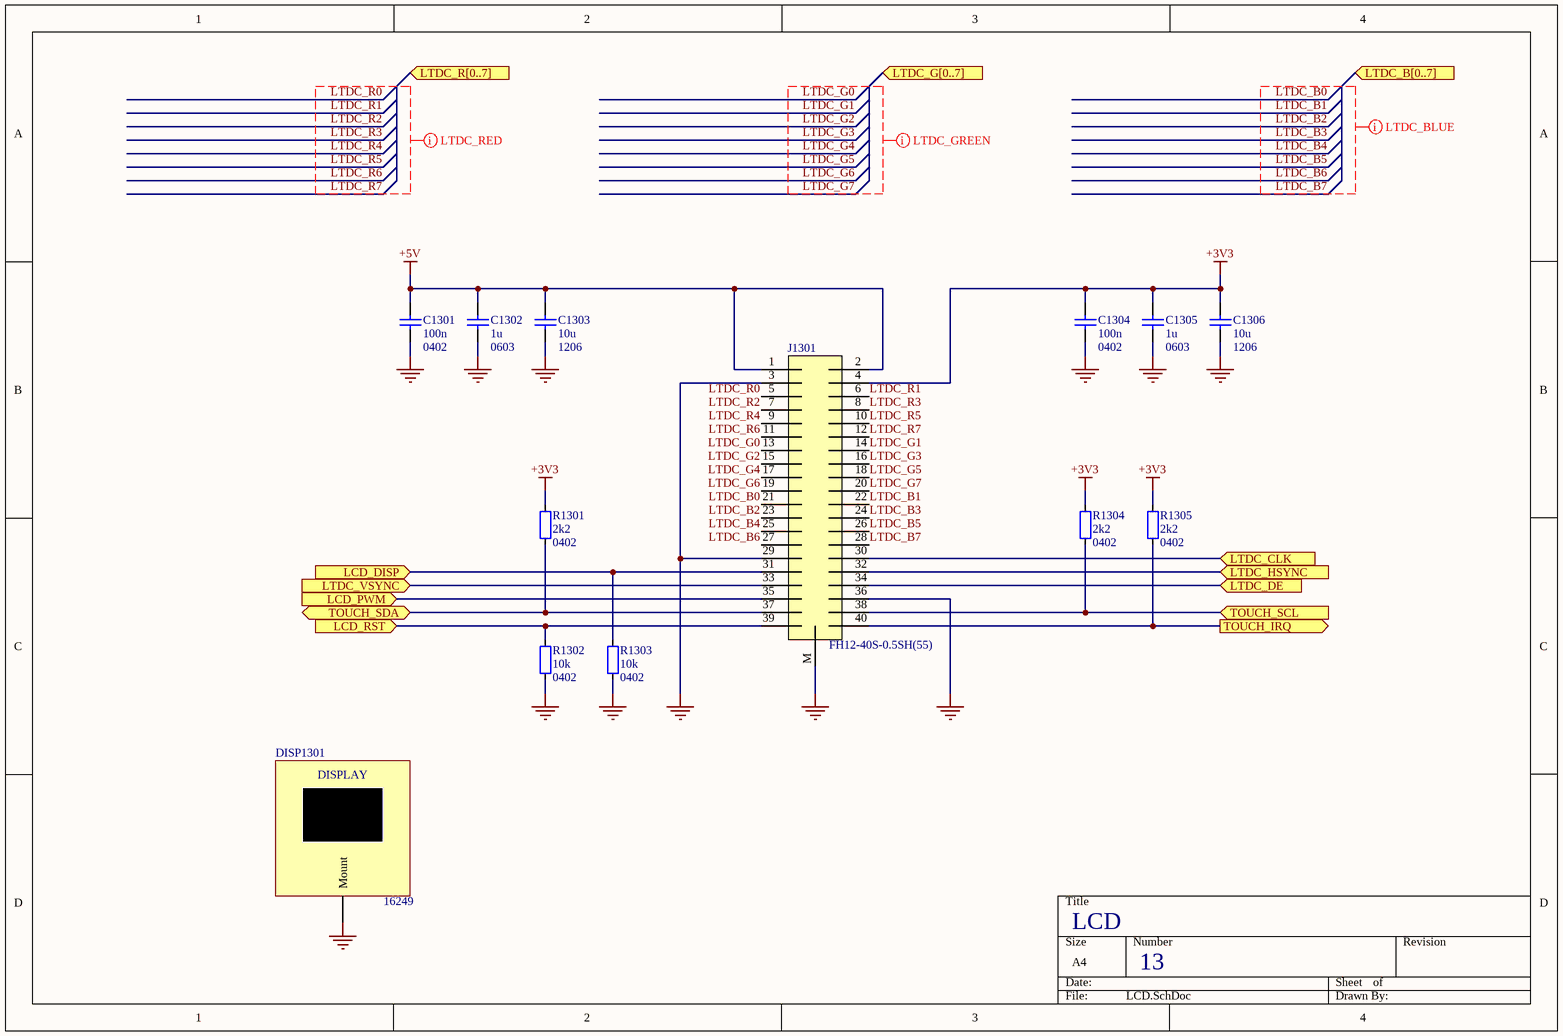
[diagram p4: LCD.SchDoc]

### Parts
C1301  100n  Footprint: 0402  [CAP_0402_B]
C1302  1u  Footprint: 0603  [CAP_0603_B]
C1303  10u  Footprint: 1206  [CAP_1206_B]
C1304  100n  Footprint: 0402  [CAP_0402_B]
C1305  1u  Footprint: 0603  [CAP_0603_B]
C1306  10u  Footprint: 1206  [CAP_1206_B]
DISP1301  16249  [Waveshare_16249]
J1301  FH12-40S-0.5SH(55)  [FH12-40S-0.5SH(55)]
R1301  2k2  Footprint: 0402  [RES_0402_A]
R1302  10k  Footprint: 0402  [RES_0402_A]
R1303  10k  Footprint: 0402  [RES_0402_A]
R1304  2k2  Footprint: 0402  [RES_0402_A]
R1305  2k2  Footprint: 0402  [RES_0402_A]

### Ports
LCD_DISP (in, see Top_Level[2A], MCU[3B]), LCD_PWM (in, see Top_Level[2A], MCU[3B]), LCD_RST (in, see Top_Level[2A], MCU[3B]), LTDC_B[0..7] (in, see Top_Level[2A], MCU[3B]), LTDC_CLK (in, see Top_Level[2A], MCU[3B]), LTDC_DE (in, see Top_Level[2B]), LTDC_G[0..7] (in, see Top_Level[2A], MCU[3B]), LTDC_HSYNC (in, see Top_Level[2A]), LTDC_R[0..7] (in, see Top_Level[2A], MCU[3B]), LTDC_VSYNC (in, see Top_Level[2A]), TOUCH_IRQ (out, see Top_Level[2B], MCU[3C]), TOUCH_SCL (in, see Top_Level[2B], MCU[3C]), TOUCH_SDA (bidir, see Top_Level[2B], MCU[3C])

### Nets
+3V3: C1304.1 C1305.1 C1306.1 J1301.4 R1301.1(a) R1304.1(a) R1305.1(a)
+5V: C1301.1 C1302.1 C1303.1 J1301.1 J1301.2
GND: C1301.2 C1302.2 C1303.2 C1304.2 C1305.2 C1306.2 DISP1301.M(Mount) J1301.3 J1301.29 J1301.36 J1301.M R1302.2(a) R1303.2(a)
LCD_DISP: J1301.31 R1303.1(a) ; port LCD_DISP
LCD_PWM: J1301.35 ; port LCD_PWM
LCD_RST: J1301.39 R1302.1(a) ; port LCD_RST
LTDC_B0: J1301.21
LTDC_B1: J1301.22
LTDC_B2: J1301.23
LTDC_B3: J1301.24
LTDC_B4: J1301.25
LTDC_B5: J1301.26
LTDC_B6: J1301.27
LTDC_B7: J1301.28
LTDC_CLK: J1301.30 ; port LTDC_CLK
LTDC_DE: J1301.34 ; port LTDC_DE
LTDC_G0: J1301.13
LTDC_G1: J1301.14
LTDC_G2: J1301.15
LTDC_G3: J1301.16
LTDC_G4: J1301.17
LTDC_G5: J1301.18
LTDC_G6: J1301.19
LTDC_G7: J1301.20
LTDC_HSYNC: J1301.32 ; port LTDC_HSYNC
LTDC_R0: J1301.5
LTDC_R1: J1301.6
LTDC_R2: J1301.7
LTDC_R3: J1301.8
LTDC_R4: J1301.9
LTDC_R5: J1301.10
LTDC_R6: J1301.11
LTDC_R7: J1301.12
LTDC_VSYNC: J1301.33 ; port LTDC_VSYNC
TOUCH_IRQ: J1301.40 R1305.2(a) ; port TOUCH_IRQ
TOUCH_SCL: J1301.38 R1304.2(a) ; port TOUCH_SCL
TOUCH_SDA: J1301.37 R1301.2(a) ; port TOUCH_SDA

### Layout directives
net class LTDC_RED: LTDC_R0, LTDC_R1, LTDC_R2, LTDC_R3, LTDC_R4, LTDC_R5, LTDC_R6, LTDC_R7
net class LTDC_GREEN: LTDC_G0, LTDC_G1, LTDC_G2, LTDC_G3, LTDC_G4, LTDC_G5, LTDC_G6, LTDC_G7
net class LTDC_BLUE: LTDC_B0, LTDC_B1, LTDC_B2, LTDC_B3, LTDC_B4, LTDC_B5, LTDC_B6, LTDC_B7

### Notes on the sheet
- (in symbol Waveshare_16249) DISPLAY

### Library data of the parts
C1301 C1304 = CAP_0402: 0402 SMD Capacitor
C1302 C1305 = CAP_0603: 0603 SMD Capacitor
C1303 C1306 = CAP_1206: 1206 SMD Capacitor
DISP1301 = Waveshare_16249: Connector for Waveshare 16249 Display.
J1301 = FH12-40S-0.5SH(55): 40 Position FFC, FPC Connector Contacts, Bottom 0.020" (0.50mm) Surface Mount, Right Angle; Supplier 1: Future Electronics; Supplier Part Number 1: FH12-40S-0.5SH(55)
R1301-R1305 = RES_0402: 0402 SMD Resistor

## Sheet SDRAM.SchDoc: SDRAM
size A4; DocumentNumber: 6; SheetNumber: 5; SheetTotal: 16
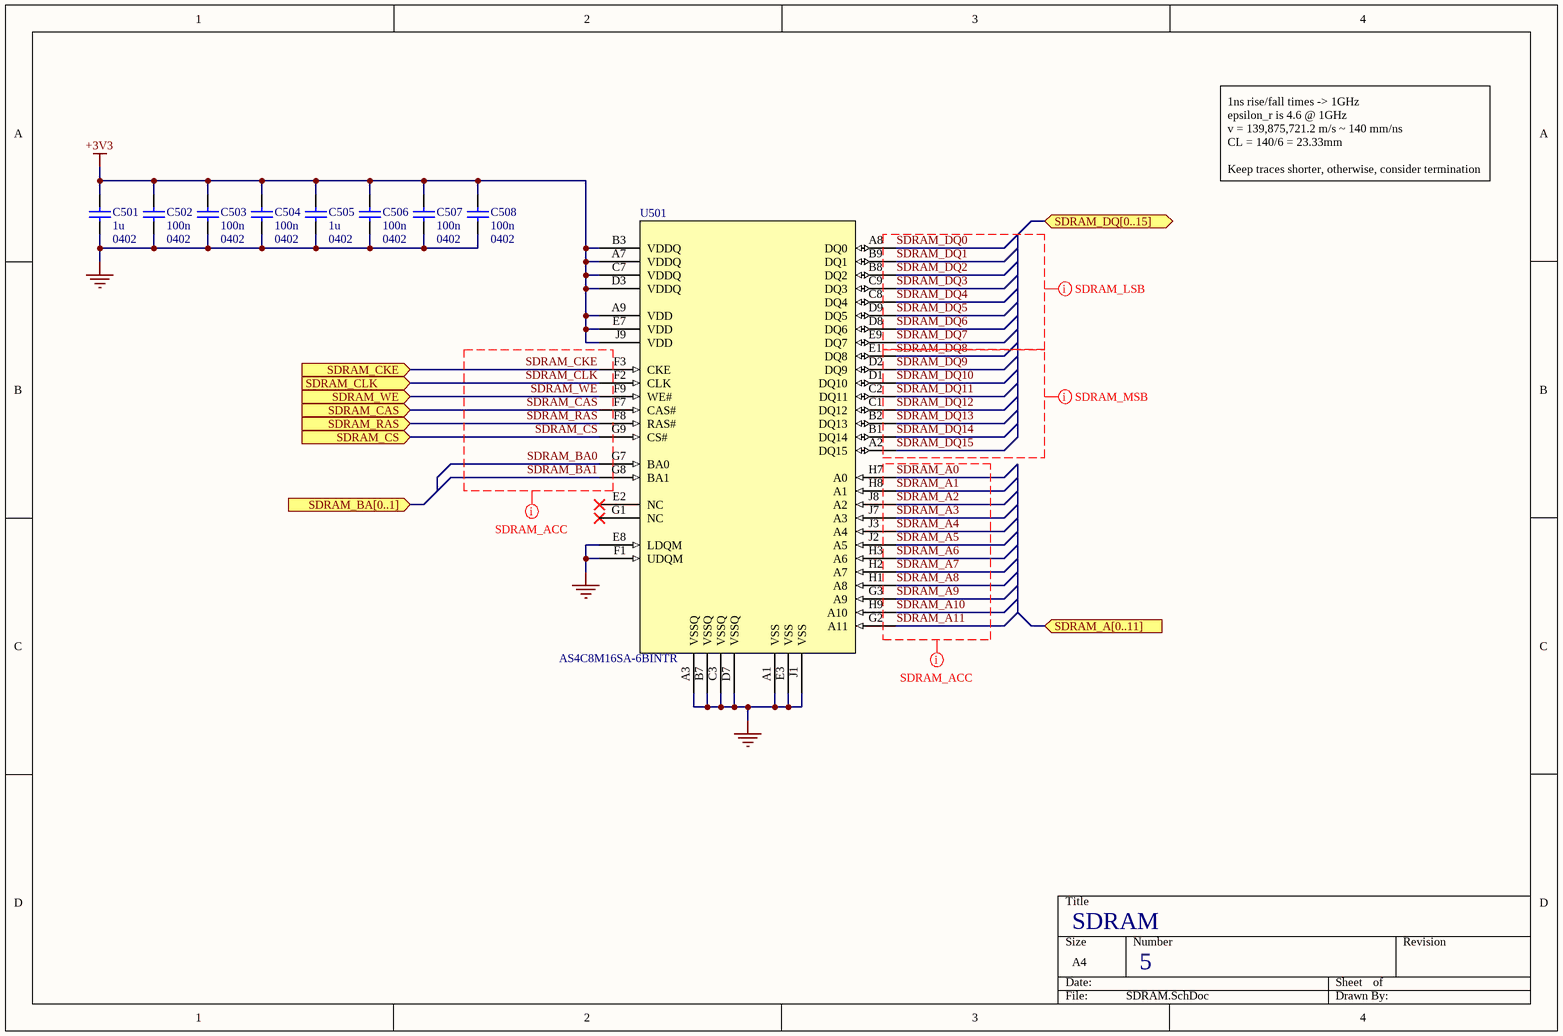
[diagram p5: SDRAM.SchDoc]

### Parts
C501  1u  Footprint: 0402  [CAP_0402_B]
C502  100n  Footprint: 0402  [CAP_0402_B]
C503  100n  Footprint: 0402  [CAP_0402_B]
C504  100n  Footprint: 0402  [CAP_0402_B]
C505  1u  Footprint: 0402  [CAP_0402_B]
C506  100n  Footprint: 0402  [CAP_0402_B]
C507  100n  Footprint: 0402  [CAP_0402_B]
C508  100n  Footprint: 0402  [CAP_0402_B]
U501  AS4C8M16SA-6BINTR  [AS4C8M16SA-6BINTR]

### Ports
SDRAM_A[0..11] (in, see Top_Level[2B], MCU[3A]), SDRAM_BA[0..1] (in, see Top_Level[2B], MCU[3A]), SDRAM_CAS (in, see Top_Level[2C], MCU[3A]), SDRAM_CKE (in, see Top_Level[2B], MCU[3A]), SDRAM_CLK (in, see Top_Level[2C], MCU[3A]), SDRAM_CS (in, see Top_Level[2C], MCU[3A]), SDRAM_DQ[0..15] (bidir, see Top_Level[2B], MCU[3A]), SDRAM_RAS (in, see Top_Level[2C], MCU[3A]), SDRAM_WE (in, see Top_Level[2C], MCU[3A])

### Nets
+3V3: C501.1 C502.1 C503.1 C504.1 C505.1 C506.1 C507.1 C508.1 U501.A7(VDDQ) U501.A9(VDD) U501.B3(VDDQ) U501.C7(VDDQ) U501.D3(VDDQ) U501.E7(VDD) U501.J9(VDD)
GND: C501.2 C502.2 C503.2 C504.2 C505.2 C506.2 C507.2 C508.2 U501.A1(VSS) U501.A3(VSSQ) U501.B7(VSSQ) U501.C3(VSSQ) U501.D7(VSSQ) U501.E3(VSS) U501.E8(LDQM) U501.F1(UDQM) U501.J1(VSS)
SDRAM_A0: U501.H7(A0)
SDRAM_A1: U501.H8(A1)
SDRAM_A2: U501.J8(A2)
SDRAM_A3: U501.J7(A3)
SDRAM_A4: U501.J3(A4)
SDRAM_A5: U501.J2(A5)
SDRAM_A6: U501.H3(A6)
SDRAM_A7: U501.H2(A7)
SDRAM_A8: U501.H1(A8)
SDRAM_A9: U501.G3(A9)
SDRAM_A10: U501.H9(A10)
SDRAM_A11: U501.G2(A11)
SDRAM_BA0: U501.G7(BA0)
SDRAM_BA1: U501.G8(BA1)
SDRAM_CAS: U501.F7(CAS#) ; port SDRAM_CAS
SDRAM_CKE: U501.F3(CKE) ; port SDRAM_CKE
SDRAM_CLK: U501.F2(CLK) ; port SDRAM_CLK
SDRAM_CS: U501.G9(CS#) ; port SDRAM_CS
SDRAM_DQ0: U501.A8(DQ0)
SDRAM_DQ1: U501.B9(DQ1)
SDRAM_DQ2: U501.B8(DQ2)
SDRAM_DQ3: U501.C9(DQ3)
SDRAM_DQ4: U501.C8(DQ4)
SDRAM_DQ5: U501.D9(DQ5)
SDRAM_DQ6: U501.D8(DQ6)
SDRAM_DQ7: U501.E9(DQ7)
SDRAM_DQ8: U501.E1(DQ8)
SDRAM_DQ9: U501.D2(DQ9)
SDRAM_DQ10: U501.D1(DQ10)
SDRAM_DQ11: U501.C2(DQ11)
SDRAM_DQ12: U501.C1(DQ12)
SDRAM_DQ13: U501.B2(DQ13)
SDRAM_DQ14: U501.B1(DQ14)
SDRAM_DQ15: U501.A2(DQ15)
SDRAM_RAS: U501.F8(RAS#) ; port SDRAM_RAS
SDRAM_WE: U501.F9(WE#) ; port SDRAM_WE

Not connected (* = marked no-connect by the designer): U501 E2(NC)* G1(NC)*

### Layout directives
net class SDRAM_LSB: SDRAM_DQ0, SDRAM_DQ1, SDRAM_DQ2, SDRAM_DQ3, SDRAM_DQ4, SDRAM_DQ5, SDRAM_DQ6, SDRAM_DQ7
net class SDRAM_ACC: SDRAM_A0, SDRAM_A1, SDRAM_A2, SDRAM_A3, SDRAM_A4, SDRAM_A5, SDRAM_A6, SDRAM_A7, SDRAM_A8, SDRAM_A9, SDRAM_A10, SDRAM_A11, SDRAM_BA0, SDRAM_BA1, SDRAM_CAS, SDRAM_CKE, SDRAM_CLK, SDRAM_CS, SDRAM_RAS, SDRAM_WE
net class SDRAM_MSB: SDRAM_DQ8, SDRAM_DQ9, SDRAM_DQ10, SDRAM_DQ11, SDRAM_DQ12, SDRAM_DQ13, SDRAM_DQ14, SDRAM_DQ15

### Notes on the sheet
- 1ns rise/fall times -> 1GHz
  epsilon_r is 4.6 @ 1GHz
  v = 139,875,721.2 m/s ~ 140 mm/ns
  CL = 140/6 = 23.33mm
  Keep traces shorter, otherwise, consider termination

### Library data of the parts
C501-C508 = CAP_0402: 0402 SMD Capacitor
U501 = AS4C8M16SA-6BINTR: SDRAM Memory IC 128Mbit Parallel 166 MHz 5 ns 54-TFBGA (8x8); Supplier 1: DigiKey; Supplier Part Number 1: 1450-AS4C8M16SA-6BINCT-ND

## Sheet ADC.SchDoc: ADC
size A4; DocumentNumber: 5; SheetNumber: 6; SheetTotal: 16
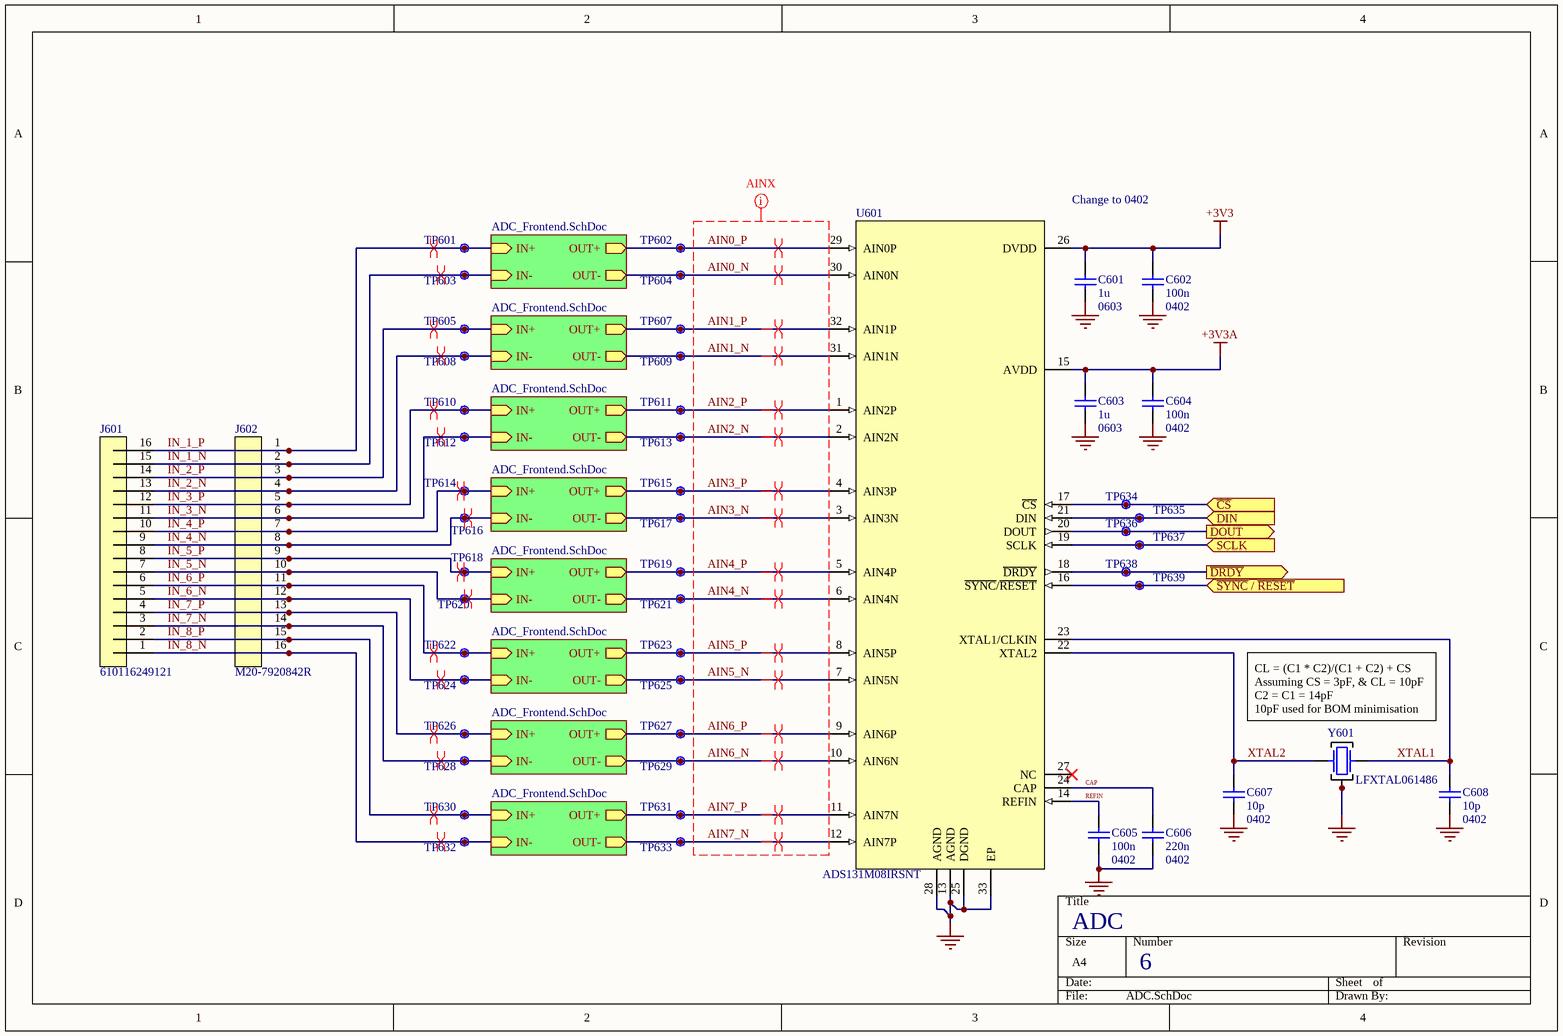
[diagram p6: ADC.SchDoc]

### Parts
C601  1u  Footprint: 0603  [CAP_0603_B]
C602  100n  Footprint: 0402  [CAP_0402_B]
C603  1u  Footprint: 0603  [CAP_0603_B]
C604  100n  Footprint: 0402  [CAP_0402_B]
C605  100n  Footprint: 0402  [CAP_0402_B]
C606  220n  Footprint: 0402  [CAP_0402_B]
C607  10p  Footprint: 0402  [CAP_0402_B]
C608  10p  Footprint: 0402  [CAP_0402_B]
J601  610116249121  [610116249121]
J602  M20-7920842R  [M20-7920842R]
TP601  Net  [Unlabelled Testpoint]  (value not drawn)
TP602  Net  [Unlabelled Testpoint]  (value not drawn)
TP603  Net  [Unlabelled Testpoint]  (value not drawn)
TP604  Net  [Unlabelled Testpoint]  (value not drawn)
TP605  Net  [Unlabelled Testpoint]  (value not drawn)
TP607  Net  [Unlabelled Testpoint]  (value not drawn)
TP608  Net  [Unlabelled Testpoint]  (value not drawn)
TP609  Net  [Unlabelled Testpoint]  (value not drawn)
TP610  Net  [Unlabelled Testpoint]  (value not drawn)
TP611  Net  [Unlabelled Testpoint]  (value not drawn)
TP612  Net  [Unlabelled Testpoint]  (value not drawn)
TP613  Net  [Unlabelled Testpoint]  (value not drawn)
TP614  Net  [Unlabelled Testpoint]  (value not drawn)
TP615  Net  [Unlabelled Testpoint]  (value not drawn)
TP616  Net  [Unlabelled Testpoint]  (value not drawn)
TP617  Net  [Unlabelled Testpoint]  (value not drawn)
TP618  Net  [Unlabelled Testpoint]  (value not drawn)
TP619  Net  [Unlabelled Testpoint]  (value not drawn)
TP620  Net  [Unlabelled Testpoint]  (value not drawn)
TP621  Net  [Unlabelled Testpoint]  (value not drawn)
TP622  Net  [Unlabelled Testpoint]  (value not drawn)
TP623  Net  [Unlabelled Testpoint]  (value not drawn)
TP624  Net  [Unlabelled Testpoint]  (value not drawn)
TP625  Net  [Unlabelled Testpoint]  (value not drawn)
TP626  Net  [Unlabelled Testpoint]  (value not drawn)
TP627  Net  [Unlabelled Testpoint]  (value not drawn)
TP628  Net  [Unlabelled Testpoint]  (value not drawn)
TP629  Net  [Unlabelled Testpoint]  (value not drawn)
TP630  Net  [Unlabelled Testpoint]  (value not drawn)
TP631  Net  [Unlabelled Testpoint]  (value not drawn)
TP632  Net  [Unlabelled Testpoint]  (value not drawn)
TP633  Net  [Unlabelled Testpoint]  (value not drawn)
TP634  Net  [Unlabelled Testpoint]  (value not drawn)
TP635  Net  [Unlabelled Testpoint]  (value not drawn)
TP636  Net  [Unlabelled Testpoint]  (value not drawn)
TP637  Net  [Unlabelled Testpoint]  (value not drawn)
TP638  Net  [Unlabelled Testpoint]  (value not drawn)
TP639  Net  [Unlabelled Testpoint]  (value not drawn)
U601  ADS131M08IRSNT  [ADS131M08IRSNT]
Y601  LFXTAL061486  [LFXTAL061486]

### Sub-sheets
ADC_Frontend = ADC_Frontend.SchDoc: IN+ (in), OUT+ (out), OUT- (out), IN- (in)
ADC_Frontend = ADC_Frontend.SchDoc: IN+ (in), OUT+ (out), OUT- (out), IN- (in)
ADC_Frontend = ADC_Frontend.SchDoc: IN+ (in), OUT+ (out), OUT- (out), IN- (in)
ADC_Frontend = ADC_Frontend.SchDoc: IN+ (in), OUT+ (out), OUT- (out), IN- (in)
ADC_Frontend = ADC_Frontend.SchDoc: IN+ (in), OUT+ (out), OUT- (out), IN- (in)
ADC_Frontend = ADC_Frontend.SchDoc: IN+ (in), OUT+ (out), OUT- (out), IN- (in)
ADC_Frontend = ADC_Frontend.SchDoc: IN+ (in), OUT+ (out), OUT- (out), IN- (in)
CH0 = ADC_Frontend.SchDoc: IN+ (in), OUT+ (out), OUT- (out), IN- (in)

### Ports
DIN (in, see Top_Level[2C]), DOUT (out, see Top_Level[2C]), SCLK (in, see Top_Level[2C]), ~{CS} (in, see Top_Level[2C]), ~{DRDY} (out, see Top_Level[2C]), ~{SYNC} / ~{RESET} (in, see Top_Level[2C])

### Nets
+3V3: C601.1 C602.1 U601.26(DVDD)
+3V3A: C603.1 C604.1 U601.15(AVDD)
GND: C601.2 C602.2 C603.2 C604.2 C605.2 C606.2 C607.2 C608.2 U601.13(AGND) U601.25(DGND) U601.28(AGND) U601.33(EP) Y601.2(GND) Y601.4(GND)
ADC_~{CS}: TP634.1 U601.17(~{CS}) ; port ~{CS}
ADC_~{DRDY}: TP638.1 U601.18(~{DRDY}) ; port ~{DRDY}
ADC_DIN: TP635.1 U601.21(DIN) ; port DIN
ADC_DOUT: TP636.1 U601.20(DOUT) ; port DOUT
ADC_~{SYNC}: TP639.1 U601.16(~{SYNC}/~{RESET}) ; port ~{SYNC} / ~{RESET}
ADC_SCLK: TP637.1 U601.19(SCLK) ; port SCLK
AIN0_N: TP604.1 U601.30(AIN0N) ; sheet CH0/OUT-
AIN0_P: TP602.1 U601.29(AIN0P) ; sheet CH0/OUT+
AIN1_N: TP609.1 U601.31(AIN1N) ; sheet ADC_Frontend/OUT-
AIN1_P: TP607.1 U601.32(AIN1P) ; sheet ADC_Frontend/OUT+
AIN2_N: TP613.1 U601.2(AIN2N) ; sheet ADC_Frontend/OUT-
AIN2_P: TP611.1 U601.1(AIN2P) ; sheet ADC_Frontend/OUT+
AIN3_N: TP617.1 U601.3(AIN3N) ; sheet ADC_Frontend/OUT-
AIN3_P: TP615.1 U601.4(AIN3P) ; sheet ADC_Frontend/OUT+
AIN4_N: TP621.1 U601.6(AIN4N) ; sheet ADC_Frontend/OUT-
AIN4_P: TP619.1 U601.5(AIN4P) ; sheet ADC_Frontend/OUT+
AIN5_N: TP625.1 U601.7(AIN5N) ; sheet ADC_Frontend/OUT-
AIN5_P: TP623.1 U601.8(AIN5P) ; sheet ADC_Frontend/OUT+
AIN6_N: TP629.1 U601.10(AIN6N) ; sheet ADC_Frontend/OUT-
AIN6_P: TP627.1 U601.9(AIN6P) ; sheet ADC_Frontend/OUT+
AIN7_N: TP633.1 U601.12(AIN7P) ; sheet ADC_Frontend/OUT-
AIN7_P: TP631.1 U601.11(AIN7N) ; sheet ADC_Frontend/OUT+
CAP: C606.1 U601.24(CAP)
IN_1_N: J601.15 J602.2 TP603.1 ; sheet CH0/IN-
IN_1_P: J601.16 J602.1 TP601.1 ; sheet CH0/IN+
IN_2_N: J601.13 J602.4 TP608.1 ; sheet ADC_Frontend/IN-
IN_2_P: J601.14 J602.3 TP605.1 ; sheet ADC_Frontend/IN+
IN_3_N: J601.11 J602.6 TP612.1 ; sheet ADC_Frontend/IN-
IN_3_P: J601.12 J602.5 TP610.1 ; sheet ADC_Frontend/IN+
IN_4_N: J601.9 J602.8 TP616.1 ; sheet ADC_Frontend/IN-
IN_4_P: J601.10 J602.7 TP614.1 ; sheet ADC_Frontend/IN+
IN_5_N: J601.7 J602.10 TP620.1 ; sheet ADC_Frontend/IN-
IN_5_P: J601.8 J602.9 TP618.1 ; sheet ADC_Frontend/IN+
IN_6_N: J601.5 J602.12 TP624.1 ; sheet ADC_Frontend/IN-
IN_6_P: J601.6 J602.11 TP622.1 ; sheet ADC_Frontend/IN+
IN_7_N: J601.3 J602.14 TP628.1 ; sheet ADC_Frontend/IN-
IN_7_P: J601.4 J602.13 TP626.1 ; sheet ADC_Frontend/IN+
IN_8_N: J601.1 J602.16 TP632.1 ; sheet ADC_Frontend/IN-
IN_8_P: J601.2 J602.15 TP630.1 ; sheet ADC_Frontend/IN+
REFIN: C605.1 U601.14(REFIN)
XTAL1: C608.1 U601.23(XTAL1/CLKIN) Y601.1(IO)
XTAL2: C607.1 U601.22(XTAL2) Y601.3(IO)

Not connected (* = marked no-connect by the designer): U601 27(NC)*

### Layout directives
differential pair: AIN0_N, AIN0_P, AIN1_N, AIN1_P, AIN2_N, AIN2_P, AIN3_N, AIN3_P, AIN4_N, AIN4_P, AIN5_N, AIN5_P, AIN6_N, AIN6_P, AIN7_N, AIN7_P, IN_1_N, IN_1_P, IN_2_N, IN_2_P, IN_3_N, IN_3_P, IN_4_N, IN_4_P, IN_5_N, IN_5_P, IN_6_N, IN_6_P, IN_7_N, IN_7_P, IN_8_N, IN_8_P
net class AINX: AIN0_N, AIN0_P, AIN1_N, AIN1_P, AIN2_N, AIN2_P, AIN3_N, AIN3_P, AIN4_N, AIN4_P, AIN5_N, AIN5_P, AIN6_N, AIN6_P, AIN7_N, AIN7_P

### Notes on the sheet
- Change to 0402
- (near Y601) CL = (C1 * C2)/(C1 + C2) + CS
  Assuming CS = 3pF, & CL = 10pF
  C2 = C1 = 14pF
  10pF used for BOM minimisation

### Library data of the parts
C601 C603 = CAP_0603: 0603 SMD Capacitor
C602 C604-C608 = CAP_0402: 0402 SMD Capacitor
J601 = 610116249121: Connector Header Surface Mount, Right Angle 16 position 0.100" (2.54mm); Supplier 1: DigiKey; Supplier Part Number 1: 732-6072-6-ND
J602 = M20-7920842R: 16 Position Receptacle Connector 0.100" (2.54mm) Surface Mount, Right Angle Gold; Supplier 1: DigiKey; Supplier Part Number 1: 952-3179-1-ND
TP601-TP605 TP607-TP639 = Unlabelled Testpoint: Symbol for an unlabelled testpoint
U601 = ADS131M08IRSNT: 24 Bit Analog to Digital Converter 8 Input 8 Sigma-Delta 32-QFN (4x4); Supplier 1: DigiKey; Supplier Part Number 1: 296-ADS131M08IRSNTCT-ND
Y601 = LFXTAL061486: 8.192 MHz ±30ppm Crystal 10pF 150 Ohms 4-SMD, No Lead; Supplier 1: DigiKey; Supplier Part Number 1: 1923-LFXTAL061486CT-ND

## Sheet ADC_Frontend.SchDoc: ADC Frontend
size A4; DocumentNumber: 16; SheetNumber: 7; SheetTotal: 16
Used 8 times, as channels ADC/CH0, ADC/ADC_Frontend, ADC/ADC_Frontend, ADC/ADC_Frontend, ADC/ADC_Frontend, ADC/ADC_Frontend, ADC/ADC_Frontend, ADC/ADC_Frontend. Parts and nets are listed once, with the designators drawn on the sheet.
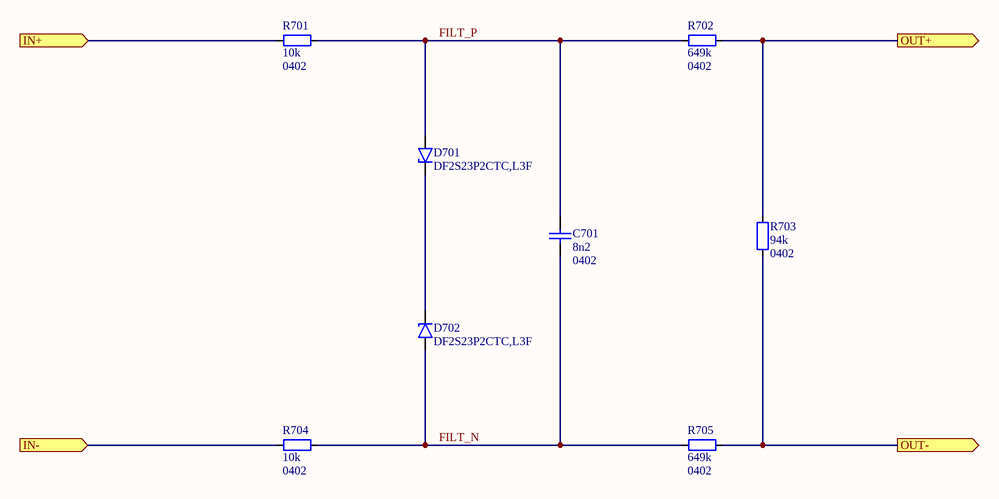
[diagram p7: ADC_Frontend.SchDoc]

### Parts
C701  8n2  Footprint: 0402  [CAP_0402_B]
D701  DF2S23P2CTC,L3F  [DF2S23P2CTC,L3F]
D702  DF2S23P2CTC,L3F  [DF2S23P2CTC,L3F]
R701  10k  Footprint: 0402  [RES_0402_A]
R702  649k  Footprint: 0402  [RES_0402_A]
R703  94k  Footprint: 0402  [RES_0402_A]
R704  10k  Footprint: 0402  [RES_0402_A]
R705  649k  Footprint: 0402  [RES_0402_A]

### Ports
IN+ (in, see ADC[2B]), IN- (in, see ADC[2B]), OUT+ (out, see ADC[2B]), OUT- (out, see ADC[2B])

### Nets
FILT_N: C701.1 D702.1(a) R704.2(a) R705.1(a)
FILT_P: C701.2 D701.1(a) R701.2(a) R702.1(a)
IN+: R701.1(a) ; port IN+
IN-: R704.1(a) ; port IN-
OUT+: R702.2(a) R703.1(a) ; port OUT+
OUT-: R703.2(a) R705.2(a) ; port OUT-
NetD701_2: D701.2 D702.2

### Channels
ADC/CH0: designators end in _8; ports IN+=IN_1_P IN-=IN_1_N OUT+=AIN0_P OUT-=AIN0_N
ADC/ADC_Frontend: designators end in _7; ports IN+=IN_2_P IN-=IN_2_N OUT+=AIN1_P OUT-=AIN1_N
ADC/ADC_Frontend: designators end in _6; ports IN+=IN_3_P IN-=IN_3_N OUT+=AIN2_P OUT-=AIN2_N
ADC/ADC_Frontend: designators end in _5; ports IN+=IN_4_P IN-=IN_4_N OUT+=AIN3_P OUT-=AIN3_N
ADC/ADC_Frontend: designators end in _4; ports IN+=IN_5_P IN-=IN_5_N OUT+=AIN4_P OUT-=AIN4_N
ADC/ADC_Frontend: designators end in _3; ports IN+=IN_6_P IN-=IN_6_N OUT+=AIN5_P OUT-=AIN5_N
ADC/ADC_Frontend: designators end in _2; ports IN+=IN_7_P IN-=IN_7_N OUT+=AIN6_P OUT-=AIN6_N
ADC/ADC_Frontend: designators end in _1; ports IN+=IN_8_P IN-=IN_8_N OUT+=AIN7_P OUT-=AIN7_N

### Library data of the parts
C701 = CAP_0402: 0402 SMD Capacitor
D701 D702 = DF2S23P2CTC,L3F: TVS DIODE 21VWM 35.7VC CST2C; Supplier 1: Avnet; Supplier Part Number 1: DF2S23P2CTC,L3F
R701-R705 = RES_0402: 0402 SMD Resistor

## Sheet Battery_Charging.SchDoc: Battery Charging
size A4; DocumentNumber: 9; SheetNumber: 14; SheetTotal: 18
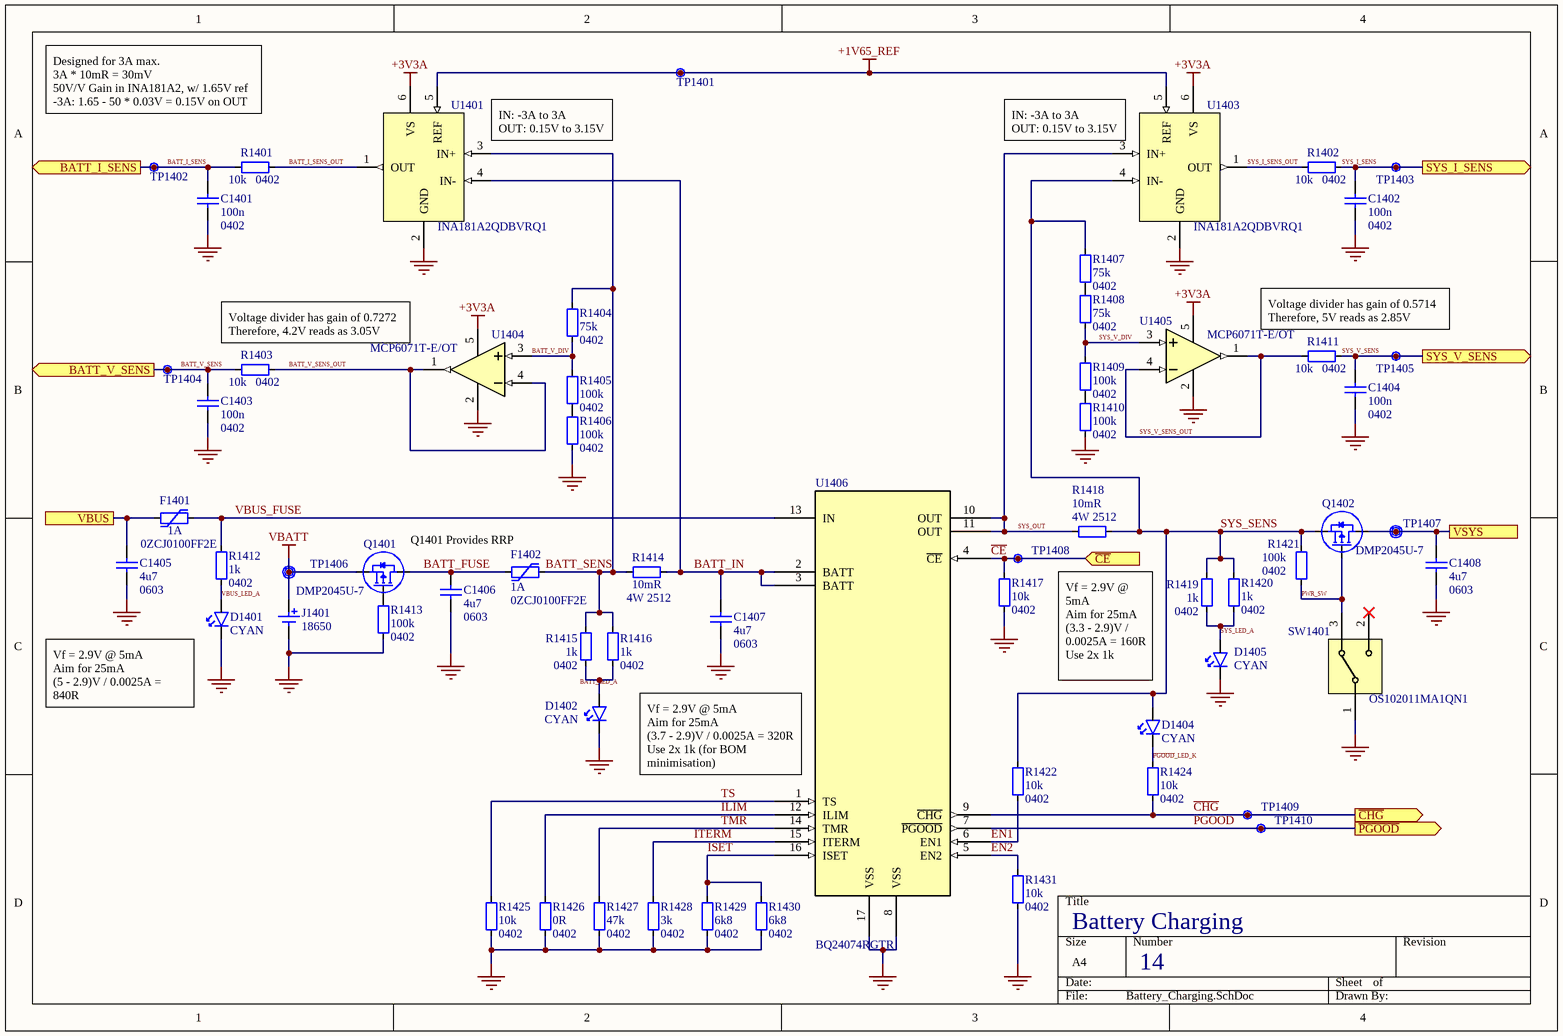
[diagram p8: Battery_Charging.SchDoc]

### Parts
C1401  100n  Footprint: 0402  [CAP_0402_B]
C1402  100n  Footprint: 0402  [CAP_0402_B]
C1403  100n  Footprint: 0402  [CAP_0402_B]
C1404  100n  Footprint: 0402  [CAP_0402_B]
C1405  4u7  Footprint: 0603  [CAP_0603_B]
C1406  4u7  Footprint: 0603  [CAP_0603_B]
C1407  4u7  Footprint: 0603  [CAP_0603_B]
C1408  4u7  Footprint: 0603  [CAP_0603_B]
D1401  CYAN  [SMLD12E3N1WT86]
D1402  CYAN  [SMLD12E3N1WT86]
D1404  CYAN  [SMLD12E3N1WT86]
D1405  CYAN  [SMLD12E3N1WT86]
F1401  1A  [0ZCJ0100FF2E]
F1402  1A  [0ZCJ0100FF2E]
J1401  18650  [1042P]
Q1401  DMP2045U-7  [DMP2045U-7]
Q1402  DMP2045U-7  [DMP2045U-7]
R1401  10k  Footprint: 0402  [RES_0402_A]
R1402  10k  Footprint: 0402  [RES_0402_A]
R1403  10k  Footprint: 0402  [RES_0402_A]
R1404  75k  Footprint: 0402  [RES_0402_A]
R1405  100k  Footprint: 0402  [RES_0402_A]
R1406  100k  Footprint: 0402  [RES_0402_A]
R1407  75k  Footprint: 0402  [RES_0402_A]
R1408  75k  Footprint: 0402  [RES_0402_A]
R1409  100k  Footprint: 0402  [RES_0402_A]
R1410  100k  Footprint: 0402  [RES_0402_A]
R1411  10k  Footprint: 0402  [RES_0402_A]
R1412  1k  Footprint: 0402  [RES_0402_A]
R1413  100k  Footprint: 0402  [RES_0402_A]
R1414  10mR  Footprint: 2512  Power: 4W  [VMS-R010-1.0-U]
R1415  1k  Footprint: 0402  [RES_0402_A]
R1416  1k  Footprint: 0402  [RES_0402_A]
R1417  10k  Footprint: 0402  [RES_0402_A]
R1418  10mR  Footprint: 2512  Power: 4W  [VMS-R010-1.0-U]
R1419  1k  Footprint: 0402  [RES_0402_A]
R1420  1k  Footprint: 0402  [RES_0402_A]
R1421  100k  Footprint: 0402  [RES_0402_A]
R1422  10k  Footprint: 0402  [RES_0402_A]
R1424  10k  Footprint: 0402  [RES_0402_A]
R1425  10k  Footprint: 0402  [RES_0402_A]
R1426  0R  Footprint: 0402  [RES_0402_A]
R1427  47k  Footprint: 0402  [RES_0402_A]
R1428  3k  Footprint: 0402  [RES_0402_A]
R1429  6k8  Footprint: 0402  [RES_0402_A]
R1430  6k8  Footprint: 0402  [RES_0402_A]
R1431  10k  Footprint: 0402  [RES_0402_A]
SW1401  OS102011MA1QN1  [OS102011MA1QN1]
TP1401  Net  [Unlabelled Testpoint]  (value not drawn)
TP1402  Net  [Unlabelled Testpoint]  (value not drawn)
TP1403  Net  [Unlabelled Testpoint]  (value not drawn)
TP1404  Net  [Unlabelled Testpoint]  (value not drawn)
TP1405  Net  [Unlabelled Testpoint]  (value not drawn)
TP1406  Net  [Labelled Testpoint]  (value not drawn)
TP1407  Net  [Labelled Testpoint]  (value not drawn)
TP1408  Net  [Unlabelled Testpoint]  (value not drawn)
TP1409  Net  [Unlabelled Testpoint]  (value not drawn)
TP1410  Net  [Unlabelled Testpoint]  (value not drawn)
U1401  INA181A2QDBVRQ1  [INA181A2QDBVRQ1]
U1403  INA181A2QDBVRQ1  [INA181A2QDBVRQ1]
U1404  MCP6071T-E/OT  [MCP6071T-E/OT]
U1405  MCP6071T-E/OT  [MCP6071T-E/OT]
U1406  BQ24074RGTR  [BQ24074RGTR]

### Ports
BATT_I_SENS (out, see Top_Level[4A], Power_Sense[1A]), BATT_V_SENS (out, see Top_Level[4A], Power_Sense[1A]), SYS_I_SENS (out, see Top_Level[4A], Power_Sense[1A]), SYS_V_SENS (out, see Top_Level[4A], Power_Sense[1A]), VBUS (see Top_Level[4A], USB[4A]), VSYS (see Top_Level[4A], 3V3_Regulators[1A], 5V_Regulator[1B]), ~{CE} (in, see Top_Level[4A], Power_Sense[1B]), ~{CHG} (out, see Top_Level[4A], Power_Sense[1A]), ~{PGOOD} (out, see Top_Level[4A], Power_Sense[1A])

### Nets
+1V65_REF: TP1401.1 U1401.5(REF) U1403.5(REF)
+3V3A: U1401.6(VS) U1403.6(VS) U1404.5(VDD) U1405.5(VDD)
GND: C1401.2 C1402.2 C1403.2 C1404.2 C1405.2 C1406.2 C1407.2 C1408.2 D1401.2 D1402.2 D1405.2 J1401.2 R1406.2(a) R1410.2(a) R1413.2(a) R1417.2(a) R1425.2(a) R1426.2(a) R1427.2(a) R1428.2(a) R1429.2(a) R1430.2(a) R1431.2(a) SW1401.1 U1401.2(GND) U1403.2(GND) U1404.2(VSS) U1405.2(VSS) U1406.8(VSS) U1406.17(VSS)
VBATT: J1401.1 Q1401.2(S) TP1406.1
VBUS: C1405.1 F1401.1(a) ; port VBUS
VSYS: C1408.1 Q1402.3(D) TP1407.1 ; port VSYS
~{PGOOD}_LED_K: D1404.2 R1424.1(a)
BATT_FUSE: C1406.1 F1402.1(a) Q1401.3(D)
BATT_I_SENS: C1401.1 R1401.1(a) TP1402.1 ; port BATT_I_SENS
BATT_I_SENS_OUT: R1401.2(a) U1401.1(OUT)
BATT_IN: C1407.1 R1414.2(a) U1401.4(IN-) U1406.2(BATT) U1406.3(BATT)
BATT_LED_A: D1402.1 R1415.2(a) R1416.2(a)
BATT_SENS: F1402.2(a) R1404.1(a) R1414.1(a) R1415.1(a) R1416.1(a) U1401.3(IN+)
BATT_V_DIV: R1404.2(a) R1405.1(a) U1404.3(VIN+)
BATT_V_SENS: C1403.1 R1403.1(a) TP1404.1 ; port BATT_V_SENS
BATT_V_SENS_OUT: R1403.2(a) U1404.1(VOUT) U1404.4(VIN-)
~{CE}: R1417.1(a) TP1408.1 U1406.4(~{CE}) ; port ~{CE}
~{CHG}: R1424.2(a) TP1409.1 U1406.9(~{CHG}) ; port ~{CHG}
EN1: R1422.2(a) U1406.6(EN1)
EN2: R1431.1(a) U1406.5(EN2)
ILIM: R1426.1(a) U1406.12(ILIM)
ISET: R1429.1(a) R1430.1(a) U1406.16(ISET)
ITERM: R1428.1(a) U1406.15(ITERM)
~{PGOOD}: TP1410.1 U1406.7(~{PGOOD}) ; port ~{PGOOD}
PWR_SW: Q1402.1(G) R1421.2(a) SW1401.3
SYS_I_SENS: C1402.1 R1402.2(a) TP1403.1 ; port SYS_I_SENS
SYS_I_SENS_OUT: R1402.1(a) U1403.1(OUT)
SYS_LED_A: D1405.1 R1419.2(a) R1420.2(a)
SYS_OUT: R1418.1(a) U1403.3(IN+) U1406.10(OUT) U1406.11(OUT)
SYS_SENS: D1404.1 Q1402.2(S) R1407.2(a) R1418.2(a) R1419.1(a) R1420.1(a) R1421.1(a) R1422.1(a) U1403.4(IN-)
SYS_V_DIV: R1408.1(a) R1409.1(a) U1405.3(VIN+)
SYS_V_SENS: C1404.1 R1411.2(a) TP1405.1 ; port SYS_V_SENS
SYS_V_SENS_OUT: R1411.1(a) U1405.1(VOUT) U1405.4(VIN-)
TMR: R1427.1(a) U1406.14(TMR)
TS: R1425.1(a) U1406.1(TS)
VBUS_FUSE: F1401.2(a) R1412.1(a) U1406.13(IN)
VBUS_LED_A: D1401.1 R1412.2(a)
NetQ1401_1: Q1401.1(G) R1413.1(a)
NetR1405_2: R1405.2(a) R1406.1(a)
NetR1407_1: R1407.1(a) R1408.2(a)
NetR1409_2: R1409.2(a) R1410.1(a)

Not connected (* = marked no-connect by the designer): SW1401 2(0)*

### Notes on the sheet
- Designed for 3A max.
  3A * 10mR = 30mV
  50V/V Gain in INA181A2, w/ 1.65V ref
  -3A: 1.65 - 50 * 0.03V = 0.15V on OUT
  0A -> 1.65V on OUT
  3A: 1.65 + 50 * 0.03V = 3.15V on OUT
- (near U1401) IN: -3A to 3A
  OUT: 0.15V to 3.15V
- (near U1403) IN: -3A to 3A
  OUT: 0.15V to 3.15V
- Voltage divider has gain of 0.7272
  Therefore, 4.2V reads as 3.05V
- Voltage divider has gain of 0.5714
  Therefore, 5V reads as 2.85V
- Q1401 Provides RRP
- (near D1401) Vf = 2.9V @ 5mA
  Aim for 25mA
  (5 - 2.9)V / 0.0025A = 840R
  Use 1k (for BOM minimisation)
- Vf = 2.9V @ 5mA
  Aim for 25mA
  (3.3 - 2.9)V / 0.0025A = 160R
  Use 2x 1k
- (near U1406) Vf = 2.9V @ 5mA
  Aim for 25mA
  (3.7 - 2.9)V / 0.0025A = 320R
  Use 2x 1k (for BOM minimisation)

### Library data of the parts
C1401-C1404 = CAP_0402: 0402 SMD Capacitor
C1405-C1408 = CAP_0603: 0603 SMD Capacitor
D1401 D1402 D1404 D1405 = LED_Generic: Part Number: SMLD12E3N1WT86; Supplier 1: DigiKey; Supplier Part Number 1: SMLD12E3N1WT86CT-ND
F1401 F1402 = FUSE_GENERIC: Generic Fuse Symbol; Part Number: 0ZCJ0100FF2E; Supplier 1: Avnet; Supplier Part Number 1: 48AC8418
J1401 = 1042P: BATTERY HOLDER 18650 SMD; Supplier 1: DigiKey; Supplier Part Number 1: 36-1042P-ND
Q1401 Q1402 = DMP2045U-7: MOSFET P-CH 20V 4.3A SOT23; Supplier 1: DigiKey; Supplier Part Number 1: DMP2045U-7DICT-ND
R1401-R1413 R1415-R1417 R1419-R1422 R1424-R1431 = RES_0402: 0402 SMD Resistor
R1414 R1418 = RES_GENERIC: VMS-R010-1.0-U; Supplier 1: DigiKey; Supplier Part Number 1: 4423-VMS-R010-1.0-UDKR-ND
SW1401 = OS102011MA1QN1: SWITCH SLIDE SPDT 100MA 12V
TP1401-TP1405 TP1408-TP1410 = Unlabelled Testpoint: Symbol for an unlabelled testpoint
TP1406 TP1407 = Labelled Testpoint: Symbol for a labelled testpoint
U1401 U1403 = INA181A2QDBVRQ1: Current Sense Amplifier 1 Circuit Rail-to-Rail SOT-23-6; Supplier 1: DigiKey; Supplier Part Number 1: 296-INA181A2QDBVRQ1CT-ND
U1404 U1405 = MCP6071T-E/OT: Standard (General Purpose) Amplifier 1 Circuit Rail-to-Rail SOT-23-5; Supplier 1: Arrow Electronics; Supplier Part Number 1: MCP6071T-E/OT
U1406 = BQ24074RGTR: Charger IC Lithium Ion 16-VQFN (3x3); Supplier 1: DigiKey; Supplier Part Number 1: 296-38873-1-ND